# EAGLE design Board Old (EAGLE 9.6.2)
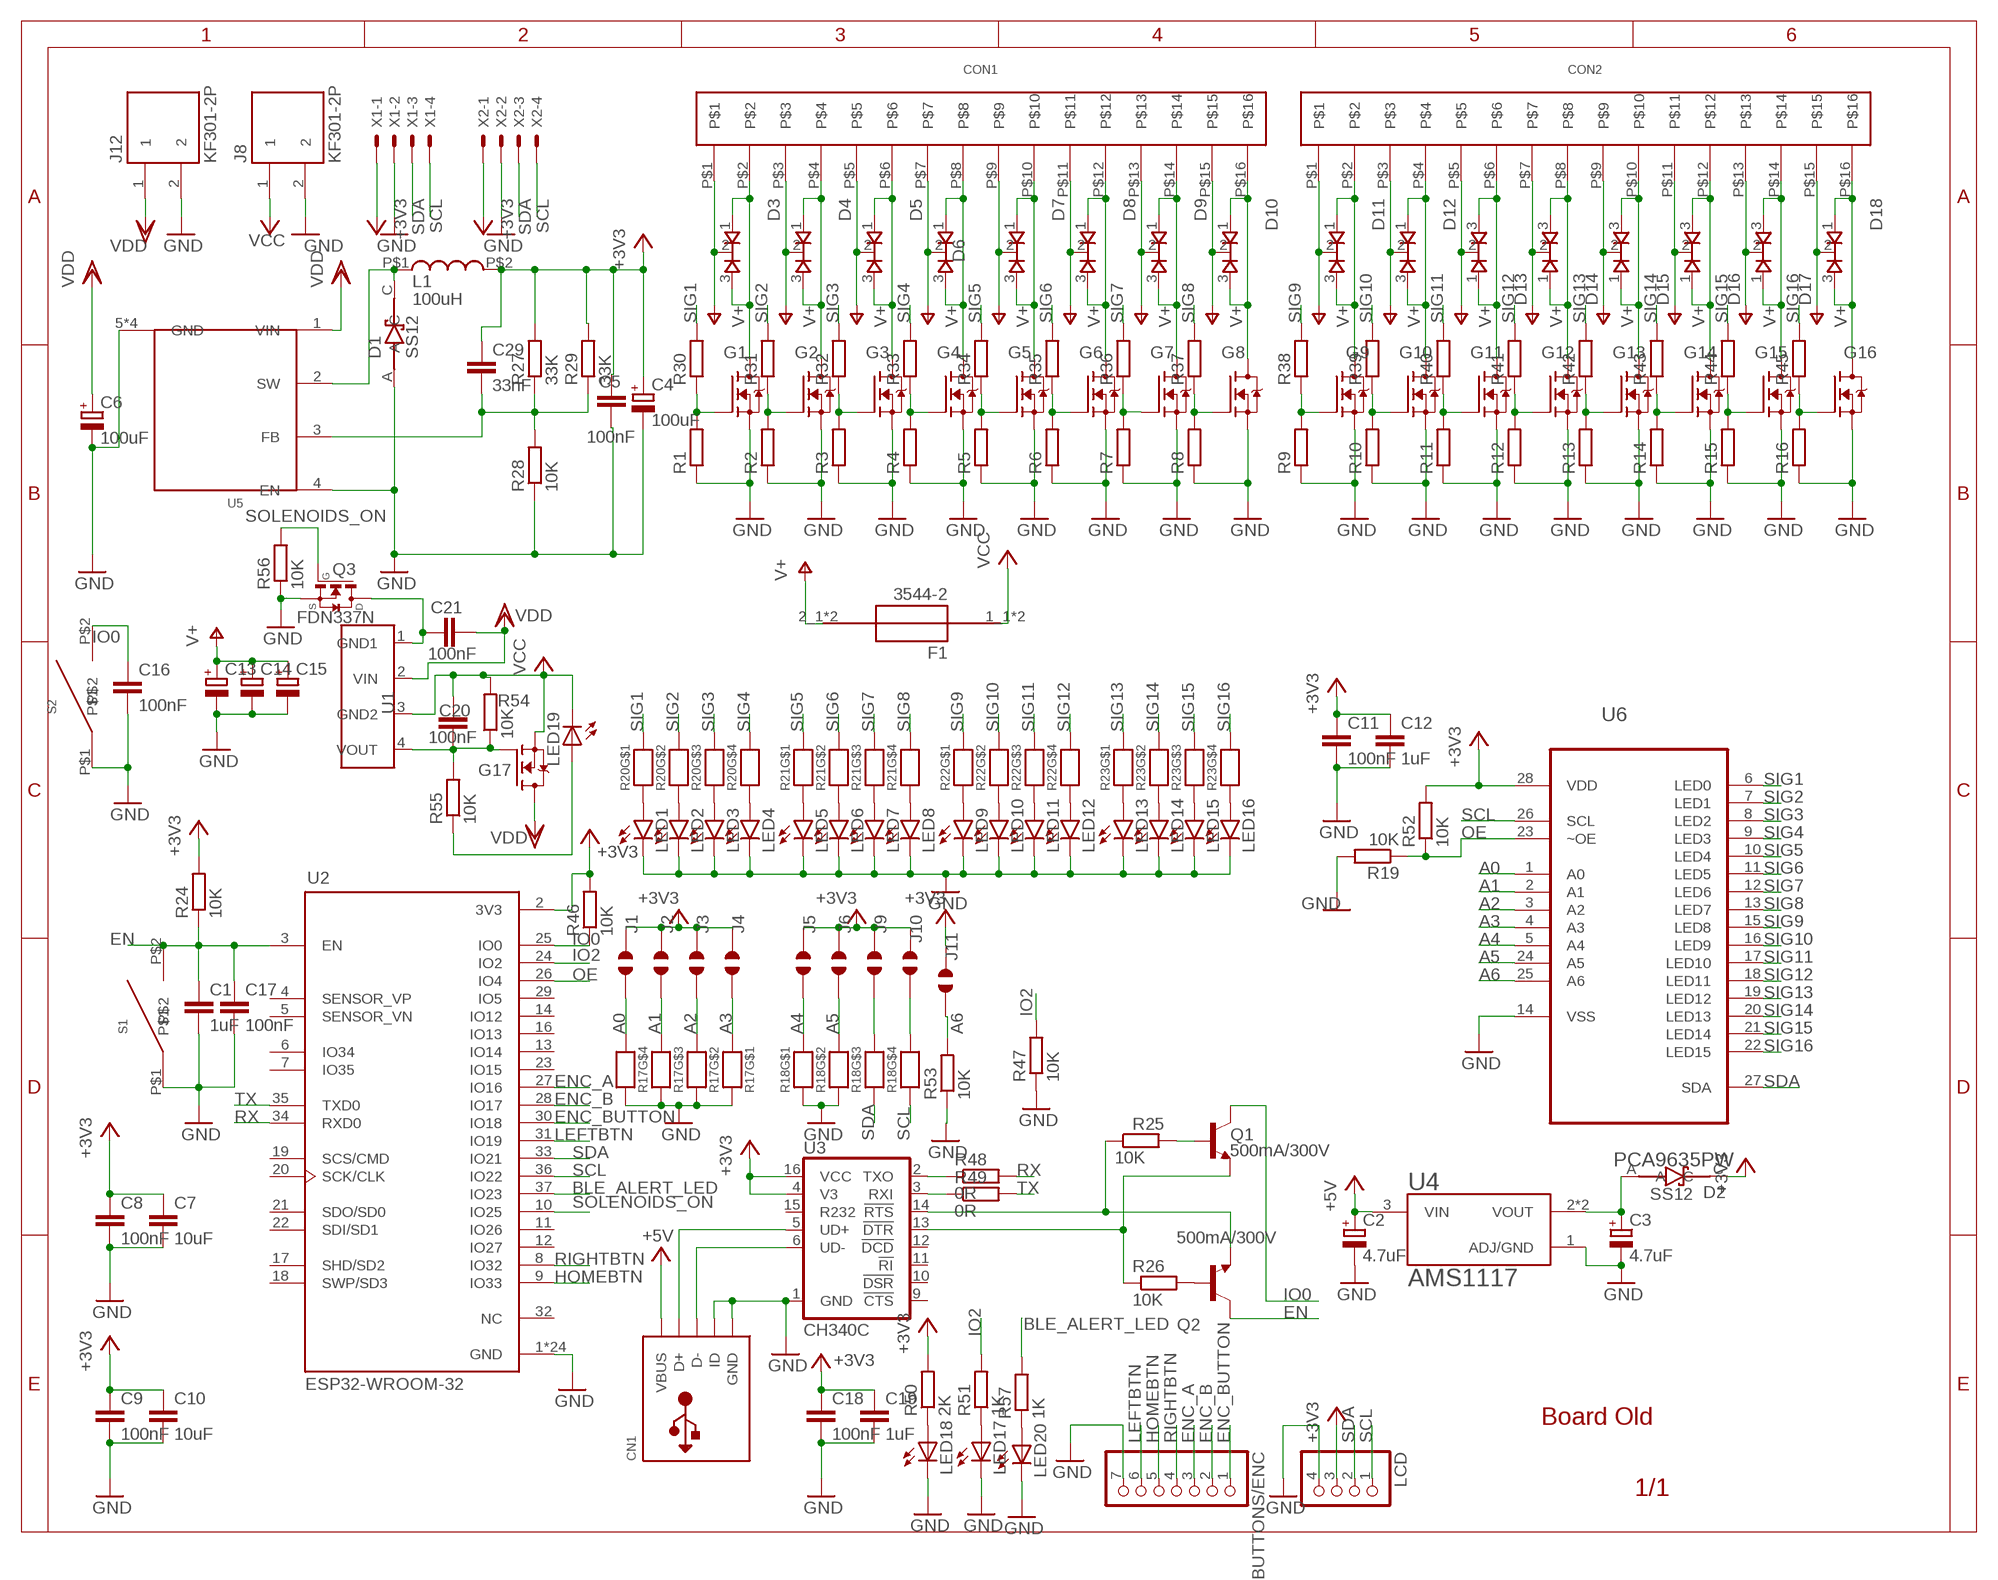
[diagram p0: schematic, sheet 1]

## Parts
BUTTONS/ENC  PINHD-1X7  [1X07]
C1  1uF  C-EUC0603  [C0603]
C2  4.7uF  CPOL-EUC/6032-28R  [C/6032-28R]
C3  4.7uF  CPOL-EUC/6032-28R  [C/6032-28R]
C4  100uF  CPOL-EUC/6032-28R  [C/6032-28R]
C5  100nF  C-EUC0603  [C0603]
C6  100uF  CPOL-EUC/6032-28R  [C/6032-28R]
C7  10uF  C-EUC0603  [C0603]
C8  100nF  C-EUC0603  [C0603]
C9  100nF  C-EUC0603  [C0603]
C10  10uF  C-EUC0603  [C0603]
C11  100nF  C-EUC0603  [C0603]
C12  1uF  C-EUC0603  [C0603]
C13  CPOL-EUE5-10.5  [E5-10,5]
C14  CPOL-EUE5-10.5  [E5-10,5]
C15  CPOL-EUE5-10.5  [E5-10,5]
C16  100nF  C-EUC0603  [C0603]
C17  100nF  C-EUC0603  [C0603]
C18  100nF  C-EUC0603  [C0603]
C19  1uF  C-EUC0603  [C0603]
C20  100nF  C-EUC0603  [C0603]
C21  100nF  C-EUC0603  [C0603]
C29  33nF  C-EUC0603  [C0603]
CN1  USBMINIB  [USB-MINIB]
CON1  2.54-16P  [2.54-16P]
CON2  2.54-16P  [2.54-16P]
D1  SS12  [DIOM4427X270N]
D2  SS12  [DIOM4427X270N]
D3  BYQ28E  [TO220V]
D4  BYQ28E  [TO220V]
D5  BYQ28E  [TO220V]
D6  BYQ28E  [TO220V]
D7  BYQ28E  [TO220V]
D8  BYQ28E  [TO220V]
D9  BYQ28E  [TO220V]
D10  BYQ28E  [TO220V]
D11  BYQ28E  [TO220V]
D12  BYQ28E  [TO220V]
D13  BYQ28E  [TO220V]
D14  BYQ28E  [TO220V]
D15  BYQ28E  [TO220V]
D16  BYQ28E  [TO220V]
D17  BYQ28E  [TO220V]
D18  BYQ28E  [TO220V]
F1  3544-2  [FUSE_3544-2]
G1  IRL540N  [TO220V]
G2  IRL540N  [TO220V]
G3  IRL540N  [TO220V]
G4  IRL540N  [TO220V]
G5  IRL540N  [TO220V]
G6  IRL540N  [TO220V]
G7  IRL540N  [TO220V]
G8  IRL540N  [TO220V]
G9  IRL540N  [TO220V]
G10  IRL540N  [TO220V]
G11  IRL540N  [TO220V]
G12  IRL540N  [TO220V]
G13  IRL540N  [TO220V]
G14  IRL540N  [TO220V]
G15  IRL540N  [TO220V]
G16  IRL540N  [TO220V]
G17  IRL540N  [TO220V]
J1  JUMPER_SOLDER_1X2  [JUMPER_SOLDER_1X2]
J2  JUMPER_SOLDER_1X2  [JUMPER_SOLDER_1X2]
J3  JUMPER_SOLDER_1X2  [JUMPER_SOLDER_1X2]
J4  JUMPER_SOLDER_1X2  [JUMPER_SOLDER_1X2]
J5  JUMPER_SOLDER_1X2  [JUMPER_SOLDER_1X2]
J6  JUMPER_SOLDER_1X2  [JUMPER_SOLDER_1X2]
J8  KF301-2P  [KF301-2P]
J9  JUMPER_SOLDER_1X2  [JUMPER_SOLDER_1X2]
J10  JUMPER_SOLDER_1X2  [JUMPER_SOLDER_1X2]
J11  JUMPER_SOLDER_1X2  [JUMPER_SOLDER_1X2]
J12  KF301-2P  [KF301-2P]
L1  100uH  CD43  [CD43]
LCD  PINHD-1X4  [1X04]
LED1  LEDSMT1206  [1206]
LED2  LEDSMT1206  [1206]
LED3  LEDSMT1206  [1206]
LED4  LEDSMT1206  [1206]
LED5  LEDSMT1206  [1206]
LED6  LEDSMT1206  [1206]
LED7  LEDSMT1206  [1206]
LED8  LEDSMT1206  [1206]
LED9  LEDSMT1206  [1206]
LED10  LEDSMT1206  [1206]
LED11  LEDSMT1206  [1206]
LED12  LEDSMT1206  [1206]
LED13  LEDSMT1206  [1206]
LED14  LEDSMT1206  [1206]
LED15  LEDSMT1206  [1206]
LED16  LEDSMT1206  [1206]
LED17  LED-0603  [LED-603]
LED18  LED-0603  [LED-603]
LED19  LED-0603  [LED-603]
LED20  LED-0603  [LED-603]
Q1  500mA/300V  TRANS_NPN-MMBTA42  [SOT23-3]
Q2  500mA/300V  TRANS_NPN-MMBTA42  [SOT23-3]
Q3  FDN337N  [SSOT-3]
R1  R-EU_R0603  [R0603]
R2  R-EU_R0603  [R0603]
R3  R-EU_R0603  [R0603]
R4  R-EU_R0603  [R0603]
R5  R-EU_R0603  [R0603]
R6  R-EU_R0603  [R0603]
R7  R-EU_R0603  [R0603]
R8  R-EU_R0603  [R0603]
R9  R-EU_R0603  [R0603]
R10  R-EU_R0603  [R0603]
R11  R-EU_R0603  [R0603]
R12  R-EU_R0603  [R0603]
R13  R-EU_R0603  [R0603]
R14  R-EU_R0603  [R0603]
R15  R-EU_R0603  [R0603]
R16  R-EU_R0603  [R0603]
R17  MICROBUILDER_RESISTOR_4PACK  [MICROBUILDER_RESPACK_4X0603]
R18  MICROBUILDER_RESISTOR_4PACK  [MICROBUILDER_RESPACK_4X0603]
R19  10K  R-EU_R1206  [R1206]
R20  MICROBUILDER_RESISTOR_4PACK  [MICROBUILDER_RESPACK_4X0603]
R21  MICROBUILDER_RESISTOR_4PACK  [MICROBUILDER_RESPACK_4X0603]
R22  MICROBUILDER_RESISTOR_4PACK  [MICROBUILDER_RESPACK_4X0603]
R23  MICROBUILDER_RESISTOR_4PACK  [MICROBUILDER_RESPACK_4X0603]
R24  10K  R-EU_R0603  [R0603]
R25  10K  R-EU_R0603  [R0603]
R26  10K  R-EU_R0603  [R0603]
R27  33K  R-EU_R0603  [R0603]
R28  10K  R-EU_R0603  [R0603]
R29  33K  R-EU_R0603  [R0603]
R30  R-EU_R0603  [R0603]
R31  R-EU_R0603  [R0603]
R32  R-EU_R0603  [R0603]
R33  R-EU_R0603  [R0603]
R34  R-EU_R0603  [R0603]
R35  R-EU_R0603  [R0603]
R36  R-EU_R0603  [R0603]
R37  R-EU_R0603  [R0603]
R38  R-EU_R0603  [R0603]
R39  R-EU_R0603  [R0603]
R40  R-EU_R0603  [R0603]
R41  R-EU_R0603  [R0603]
R42  R-EU_R0603  [R0603]
R43  R-EU_R0603  [R0603]
R44  R-EU_R0603  [R0603]
R45  R-EU_R0603  [R0603]
R46  10K  R-EU_R0603  [R0603]
R47  10K  R-EU_R0603  [R0603]
R48  0R  R-EU_R0603  [R0603]
R49  0R  R-EU_R0603  [R0603]
R50  2K  R-EU_R0603  [R0603]
R51  1K  R-EU_R0603  [R0603]
R52  10K  R-EU_R0603  [R0603]
R53  10K  R-EU_R0603  [R0603]
R54  10K  R-EU_R0603  [R0603]
R55  10K  R-EU_R0603  [R0603]
R56  10K  R-EU_R0603  [R0603]
R57  1K  R-EU_R0603  [R0603]
S1  3X6X2.5  [3X6X2.5]
S2  3X6X2.5  [3X6X2.5]
U1  B1212  [CONV_PDS1-S15-S12-S]
U2  ESP32-WROOM-32  [MODULE_ESP32-WROOM-32]
U3  CH340C  [SO016]
U4  AMS1117  [SOT229P700X180-4N]
U5  XL7005A  [SO8]
U6  PCA9635PW  [SOP65P640X110-28N]
X1  JST-XH-04-PIN-LONG-PAD  [JST-XH-04-PACKAGE-LONG-PAD]
X2  JST-XH-04-PIN-LONG-PAD  [JST-XH-04-PACKAGE-LONG-PAD]

## Nets
+3V3: C4.+ C5.1 C7.1 C8.1 C9.1 C10.1 C11.1 C12.1 C18.1 C19.1 C29.1 D2.C J1.1 J2.1 J3.1 J4.1 J5.1 J6.1 J9.1 J10.1 J11.1 L1.P$2 LCD.3 R24.2 R27.2 R29.2 R46.2 R50.2 R52.2 U2.2(3V3) U3.4(V3) U3.16(VCC) U6.28(VDD) X1.1 X2.1
+5V: C2.+ CN1.VBUS U4.3(VIN)
A0: J1.2 R17.4 U6.1(A0)
A1: J2.2 R17.3 U6.2(A1)
A2: J3.2 R17.2 U6.3(A2)
A3: J4.2 R17.1 U6.4(A3)
A4: J5.2 R18.8 U6.5(A4)
A5: J6.2 R18.7 U6.24(A5)
A6: J11.2 R53.2 U6.25(A6)
BLE_ALERT_LED: R57.2 U2.37(IO23)
EN: C1.1 C17.1 Q2.3(C) R24.1 S1.P$2 U2.3(EN)
ENC_A: BUTTONS/ENC.3 U2.27(IO16)
ENC_B: BUTTONS/ENC.2 U2.28(IO17)
ENC_BUTTON: BUTTONS/ENC.1 U2.30(IO18)
GND: BUTTONS/ENC.7 C1.2 C2.- C3.- C4.- C5.2 C6.- C7.2 C8.2 C9.2 C10.2 C11.2 C12.2 C13.- C14.- C15.- C16.2 C17.2 C18.2 C19.2 CN1.GND CN1.ID D1.A G1.3(S) G2.3(S) G3.3(S) G4.3(S) G5.3(S) G6.3(S) G7.3(S) G8.3(S) G9.3(S) G10.3(S) G11.3(S) G12.3(S) G13.3(S) G14.3(S) G15.3(S) G16.3(S) J8.2 J12.2 LCD.4 LED1.C LED2.C LED3.C LED4.C LED5.C LED6.C LED7.C LED8.C LED9.C LED10.C LED11.C LED12.C LED13.C LED14.C LED15.C LED16.C LED17.C LED18.C LED20.C Q3.2(S) R1.1 R2.1 R3.1 R4.1 R5.1 R6.1 R7.1 R8.1 R9.1 R10.1 R11.1 R12.1 R13.1 R14.1 R15.1 R16.1 R17.5 R17.6 R17.7 R17.8 R18.1 R18.2 R19.2 R28.1 R47.1 R53.1 R56.1 S1.P$1 S2.P$1 U2.1(GND) U2.15(GND) U2.38(GND) U2.39_1(GND) U2.39_2(GND) U2.39_3(GND) U2.39_4(GND) U2.39_5(GND) U2.39_6(GND) U2.39_7(GND) U2.39_8(GND) U2.39_9(GND) U2.39_10(GND) U2.39_11(GND) U2.39_12(GND) U2.39_13(GND) U2.39_14(GND) U2.39_15(GND) U2.39_16(GND) U2.39_17(GND) U2.39_18(GND) U2.39_19(GND) U2.39_20(GND) U2.39_21(GND) U3.1(GND) U4.1(ADJ/GND) U5.4(EN) U5.5(GND) U5.6(GND) U5.7(GND) U5.8(GND) U6.14(VSS) X1.2 X2.2
HOMEBTN: BUTTONS/ENC.5 U2.9(IO33)
IO0: C16.1 Q1.3(C) R46.1 S2.P$2 U2.25(IO0)
IO2: R47.2 R51.2 U2.24(IO2)
LEFTBTN: BUTTONS/ENC.6 U2.31(IO19)
N$1 [power]: CON1.P$2 D3.1 D3.3 G1.2(D)
N$2 [power]: CON1.P$4 D4.1 D4.3 G2.2(D)
N$3 [power]: CON1.P$6 D5.1 D5.3 G3.2(D)
N$4 [power]: CON1.P$8 D6.1 D6.3 G4.2(D)
N$5 [power]: CON1.P$10 D7.1 D7.3 G5.2(D)
N$6 [power]: CON1.P$12 D8.1 D8.3 G6.2(D)
N$7 [power]: CON1.P$14 D9.1 D9.3 G7.2(D)
N$8 [power]: CON1.P$16 D10.1 D10.3 G8.2(D)
N$9 [power]: CON2.P$2 D11.1 D11.3 G9.2(D)
N$10 [power]: CON2.P$4 D12.1 D12.3 G10.2(D)
N$11 [power]: CON2.P$6 D13.1 D13.3 G11.2(D)
N$12 [power]: CON2.P$8 D14.1 D14.3 G12.2(D)
N$13 [power]: CON2.P$10 D15.1 D15.3 G13.2(D)
N$14 [power]: CON2.P$12 D16.1 D16.3 G14.2(D)
N$15 [power]: CON2.P$14 D17.1 D17.3 G15.2(D)
N$16 [power]: CON2.P$16 D18.1 D18.3 G16.2(D)
N$17: Q1.1(B) R25.2
N$18: Q2.1(B) R26.2
N$19: LED1.A R20.1
N$20: LED2.A R20.2
N$21: LED3.A R20.3
N$22: LED4.A R20.4
N$23: LED5.A R21.1
N$24: LED6.A R21.2
N$25: LED7.A R21.3
N$26: G1.1(G) R1.2 R30.1
N$27: LED8.A R21.4
N$28: LED9.A R22.1
N$29: LED10.A R22.2
N$30: LED11.A R22.3
N$31: LED12.A R22.4
N$32: LED13.A R23.1
N$33: LED14.A R23.2
N$34: LED15.A R23.3
N$35: Q2.2(E) R25.1 U3.14(!RTS)
N$36: Q1.2(E) R26.1 U3.13(!DTR)
N$37: C20.2 G17.1(G) R54.1 R55.2 U1.4(VOUT)
N$38: J9.2 R18.6
N$39: CN1.D- U3.6(UD-)
N$40: CN1.D+ U3.5(UD+)
N$41: J10.2 R18.5
N$42: C3.+ D2.A U4.2(VOUT) U4.4(VOUT)
N$43: LED16.A R23.4
N$44: C29.2 R27.1 R28.2 R29.1 U5.3(FB)
N$45: G2.1(G) R2.2 R31.1
N$46: R48.1 U3.2(TXO)
N$47: G3.1(G) R3.2 R32.1
N$48: R49.1 U3.3(RXI)
N$49: G4.1(G) R4.2 R33.1
N$50: LED20.A R57.1
N$51: G5.1(G) R5.2 R34.1
N$52: G6.1(G) R6.2 R35.1
N$53: G7.1(G) R7.2 R36.1
N$54: LED18.A R50.1
N$55: G8.1(G) R8.2 R37.1
N$56: G9.1(G) R9.2 R38.1
N$57: G10.1(G) R10.2 R39.1
N$58: G11.1(G) R11.2 R40.1
N$59: G12.1(G) R12.2 R41.1
N$60: G13.1(G) R13.2 R42.1
N$61: G14.1(G) R14.2 R43.1
N$62: G15.1(G) R15.2 R44.1
N$63: G16.1(G) R16.2 R45.1
N$64: LED17.A R51.1
N$65: D1.C L1.P$1 U5.2(SW)
N$66: LED19.A R55.1
N$67: C21.1 Q3.3(D) U1.1(GND1)
OE: R19.1 R52.1 U2.26(IO4) U6.23(~OE)
RIGHTBTN: BUTTONS/ENC.4 U2.8(IO32)
RX: R48.2 U2.34(RXD0)
SCL: LCD.1 R18.4 U2.36(IO22) U6.26(SCL) X1.4 X2.4
SDA: LCD.2 R18.3 U2.33(IO21) U6.27(SDA) X1.3 X2.3
SIG1: R20.8 R30.2 U6.6(LED0)
SIG2: R20.7 R31.2 U6.7(LED1)
SIG3: R20.6 R32.2 U6.8(LED2)
SIG4: R20.5 R33.2 U6.9(LED3)
SIG5: R21.8 R34.2 U6.10(LED4)
SIG6: R21.7 R35.2 U6.11(LED5)
SIG7: R21.6 R36.2 U6.12(LED6)
SIG8: R21.5 R37.2 U6.13(LED7)
SIG9: R22.8 R38.2 U6.15(LED8)
SIG10: R22.7 R39.2 U6.16(LED9)
SIG11: R22.6 R40.2 U6.17(LED10)
SIG12: R22.5 R41.2 U6.18(LED11)
SIG13: R23.8 R42.2 U6.19(LED12)
SIG14: R23.7 R43.2 U6.20(LED13)
SIG15: R23.6 R44.2 U6.21(LED14)
SIG16: R23.5 R45.2 U6.22(LED15)
SOLENOIDS_ON: Q3.1(G) R56.2 U2.10(IO25)
TX: R49.2 U2.35(TXD0)
V+: C13.+ C14.+ C15.+ CON1.P$1 CON1.P$3 CON1.P$5 CON1.P$7 CON1.P$9 CON1.P$11 CON1.P$13 CON1.P$15 CON2.P$1 CON2.P$3 CON2.P$5 CON2.P$7 CON2.P$9 CON2.P$11 CON2.P$13 CON2.P$15 D3.2 D4.2 D5.2 D6.2 D7.2 D8.2 D9.2 D10.2 D11.2 D12.2 D13.2 D14.2 D15.2 D16.2 D17.2 D18.2 F1.2_1 F1.2_2
VCC [power]: C20.1 F1.1_1 F1.1_2 G17.3(S) J8.1 LED19.C R54.2 U1.3(GND2)
VDD [power]: C6.+ C21.2 G17.2(D) J12.1 U1.2(VIN) U5.1(VIN)
Unconnected: U2.4(SENSOR_VP) U2.5(SENSOR_VN) U2.6(IO34) U2.7(IO35) U2.11(IO26) U2.12(IO27) U2.13(IO14) U2.14(IO12) U2.16(IO13) U2.17(SHD/SD2) U2.18(SWP/SD3) U2.19(SCS/CMD) U2.20(SCK/CLK) U2.21(SDO/SD0) U2.22(SDI/SD1) U2.23(IO15) U2.29(IO5) U2.32(NC) U3.9(!CTS) U3.10(!DSR) U3.11(!RI) U3.12(!DCD) U3.15(R232)

## Library data of the parts
BUTTONS/ENC = pinhead:PINHD-1X7: PIN HEADER
C1 C5 C7-C12 C16-C21 C29 = rcl:C-EU: CAPACITOR, European symbol; SPICEPREFIX: C
C2-C4 C6 C13-C15 = rcl:CPOL-EU: POLARIZED CAPACITOR, European symbol; SPICEPREFIX: C
CN1 = adafruit:USB: USB Connectors USBMINIB - Surface Mount Female Mini-B USB Connector 4UConnector: 06564 By microbuilder.eu Thru-hole RA Female Mini-B USB Connector 4UConnector: 18732 By ladyada.net
CON1 CON2 = Screw Terminals:2.54-16P
D1 D2 = SS12:SS12: SS12 Series 500 mV 1 A 20 V Max Reverse Voltage Schottky Rectifier - DO-214AC Check prices <https://pricing.snapeda.com/parts/SS12/ON%20Semiconductor/view-part?ref=eda>; AVAILABILITY: In Stock; DESCRIPTION: 3/8 Hex Socket Nut Driver 3.75 (95.3mm); MF: ON Semiconductor; MP: SS12; PACKAGE: SMA-2 ON Semiconductor; PRICE: None; PURCHASE-URL: https://pricing.snapeda.com/search/part/SS12/?ref=eda
D3-D18 = BYQ28E:BYQ28E
F1 = 3544-2 Mini Auto Blade Fuse Holder:3544-2: Fuse Clip; 500 VAC; 30 A; PCB; For 0.110 in. x 0.032 in. mini blade fuses Check availability <https://pricing.snapeda.com/parts/3544-2/Keystone%20Electronics/view-part?ref=eda>; AVAILABILITY: In Stock; DESCRIPTION: THM-Vertical Entry Mini Auto Fuse Holder; MF: Keystone Electronics; MP: 3544-2; PACKAGE: None; PRICE: None; PURCHASE-URL: https://pricing.snapeda.com/search/part/3544-2/?ref=eda
G1-G17 = IRL540N:IRL540N
J1-J6 J9-J11 = dp_devices:JUMPER_SOLDER_1X2
J8 J12 = Screw Terminals:KF301-2P: 2 Pin Terminal Block 5mm Pitch Check availability <https://pricing.snapeda.com/parts/KF301-2P/Handson%20Technology/view-part?ref=eda>; AVAILABILITY: Not in stock; DESCRIPTION: 2 Pin Terminal Block 5mm Pitch; MF: Handson Technology; MP: KF301-2P; PACKAGE: None; PRICE: None
L1 = CDXX Unshielded Inductors:CD43
LCD = pinhead:PINHD-1X4: PIN HEADER
LED1-LED16 = led:LED: LED OSRAM: - CHIPLED LG R971, LG N971, LY N971, LG Q971, LY Q971, LO R971, LY R971 LH N974, LH R974 LS Q976, LO Q976, LY Q976 LO Q996 - Hyper CHIPLED LW Q18S LB Q993, LB Q99A, LB R99A - SideLED LS A670, LO A670, LY A670, LG A670, LP A670 LB A673, LV A673, LT A673, LW A673 LH A674 LY A675 LS A676, LA A676, LO A676, LY A676, LW A676 LS A679, LY A679, LG A679 - Hyper Micro SIDELED® LS Y876, LA Y876, LO Y876, LY Y876 LT Y87S - SmartLED LW L88C, LW L88S LB L89C, LB L89S, LG L890 LS L89K, LO L89K, LY L89K LS L896, LA L896, LO L896, LY L896 - TOPLED LS T670, LO T670, LY T670, LG T670, LP T670 LSG T670, LSP T670, LSY T670, LOP T670, LYG T670 LG T671, LOG T671, LSG T671 LB T673, LV T673, LT T673, LW T673 LH T674 LS T676, LA T676, LO T676, LY T676, LB T676, LH T676, LSB T676, LW T676 LB T67C, LV T67C, LT T67C, LS T67K, LO T67K, LY T67K, LW E67C LS E67B, LA E67B, LO E67B, LY E67B, LB E67C, LV E67C, LT E67C LW T67C LS T679, LY T679, LG T679 LS T770, LO T770, LY T770, LG T770, LP T770 LB T773, LV T773, LT T773, LW T773 LH T774 LS E675, LA E675, LY E675, LS T675 LS T776, LA T776, LO T776, LY T776, LB T776 LHGB T686 LT T68C, LB T68C - Hyper Mini TOPLED® LB M676 - Mini TOPLED Santana® LG M470 LS M47K, LO M47K, LY M47K Source: http://www.osram.convergy.de LUXEON: - LUMILED® LXK2-PW12-R00, LXK2-PW12-S00, LXK2-PW14-U00, LXK2-PW14-V00 LXK2-PM12-R00, LXK2-PM12-S00, LXK2-PM14-U00 LXK2-PE12-Q00, LXK2-PE12-R00, LXK2-PE12-S00, LXK2-PE14-T00, LXK2-PE14-U00 LXK2-PB12-K00, LXK2-PB12-L00, LXK2-PB12-M00, LXK2-PB14-N00, LXK2-PB14-P00, LXK2-PB14-Q00 LXK2-PR12-L00, LXK2-PR12-M00, LXK2-PR14-Q00, LXK2-PR14-R00 LXK2-PD12-Q00, LXK2-PD12-R00, LXK2-PD12-S00 LXK2-PH12-R00, LXK2-PH12-S00 LXK2-PL12-P00, LXK2-PL12-Q00, LXK2-PL12-R00 Source: www.luxeon.com KINGBRIGHT: KA-3528ASYC Source: www.kingbright.com
LED17-LED20 = dp_devices:LED: Light Emitting Diode
Q1 Q2 = SparkFun-DiscreteSemi:TRANS_NPN: NPN transistor Current controlled devices typically used to amplify current or used as a switch. BC547 - COM-08928 <http://www.sparkfun.com/products/8928> (TO-92 45V 100mA) (1.Collector 2.Base 3.Emitter) 2N3904 - COM-00521 <http://www.sparkfun.com/products/521> (TO-92 40V 200mA) (1.Emitter 2.Base 3.Collector) P2N2222A - COM-12852 <http://www.sparkfun.com/products/12852> (TO-92 40V 600mA) (1.Collector 2.Base 3.Emitter); PROD_ID: TRANS-09116
Q3 = FDN337N:FDN337N: N-Channel MOSFET Logic Level Enhancement Mode Field Effect Transistor Check prices <https://pricing.snapeda.com/parts/FDN337N/ON%20Semiconductor/view-part?ref=eda>; AVAILABILITY: In Stock; DESCRIPTION: FDN337 Series 30 V 65 mOhm N-Ch Field Effect Transistor - SSOT-3; MF: ON Semiconductor; MP: FDN337N; PACKAGE: TO-236-3 ON; PRICE: None; PURCHASE-URL: https://pricing.snapeda.com/search/part/FDN337N/?ref=eda
R1-R16 R19 R24-R57 = rcl:R-EU_: RESISTOR, European symbol; SPICEPREFIX: R
R17 R18 R20-R23 = Adafruit PCA9685 rev C:MICROBUILDER_RESISTOR_4PACK: Resistor Packs (4 resistors) 4 x 0603 10K 1/16W - Digikey: YC164J-10KCT-ND
S1 S2 = Microbuttons:3X6X2.5
U1 = B1212:B1212
U2 = ESP32-WROOM-32:ESP32-WROOM-32: Check availability <https://pricing.snapeda.com/parts/ESP32-WROOM-32/Espressif%20Systems/view-part?ref=eda>; AVAILABILITY: In Stock; DESCRIPTION: Bluetooth, WiFi 802.11b/g/n, Bluetooth v4.2 +EDR, Class 1, 2 and 3 Transceiver Module 2.4GHz ~ 2.5GHz Antenna Not Included, U.FL Surface Mount; MF: Espressif Systems; MP: ESP32-WROOM-32; PACKAGE: Module Espressif Systems; PRICE: None; PURCHASE-URL: https://pricing.snapeda.com/search/part/ESP32-WROOM-32/?ref=eda
U3 = CH340C:CH340C; AVAILABILITY: Unavailable; DESCRIPTION: USB to serial chip CH340; MF: WCH; MP: CH340C; PACKAGE: Package; PRICE: None
U4 = AMS1117:AMS1117: Sot223/Pkg 1-Amp 5-Volt Low Drop Out Voltage Regulatator Check prices <https://pricing.snapeda.com/parts/AMS1117/Advanced%20Monolithic%20Systems/view-part?ref=eda>; AVAILABILITY: In Stock; DESCRIPTION: 1A LOW DROPOUT VOLTAGE REGULATOR SOT-223; MF: Advanced Monolithic Systems; MP: AMS1117; PACKAGE: SOT-223 Seeed Technology; PRICE: None
U5 = XL7005A:XL7005A
U6 = PCA9635PW:PCA9635PW: 16-bit Fm+ I2C-bus LED driver Check availability <https://pricing.snapeda.com/parts/PCA9635PW/NXP%20Semiconductors/view-part?ref=eda>; AVAILABILITY: In Stock; DESCRIPTION: LED Driver IC 16 Output Linear - PWM Dimming 25mA 28-TSSOP; MF: NXP Semiconductors; MP: PCA9635PW; PACKAGE: TSSOP-28 NXP USA; PRICE: None; PURCHASE-URL: https://pricing.snapeda.com/search/part/PCA9635PW/?ref=eda
X1 X2 = Rembrandt Electronics - JST XH Connectors v1-0:JST-XH-04-PIN: JST XH Connector 2 Pin Wire to board connector. Pitch: 2,54 mm, (0.100") Number of pins: 4 Created by Rembrandt Electronics www.rembrandtelectronics.com

## Net classes
1 power: clearance 0.254 mm

## Board
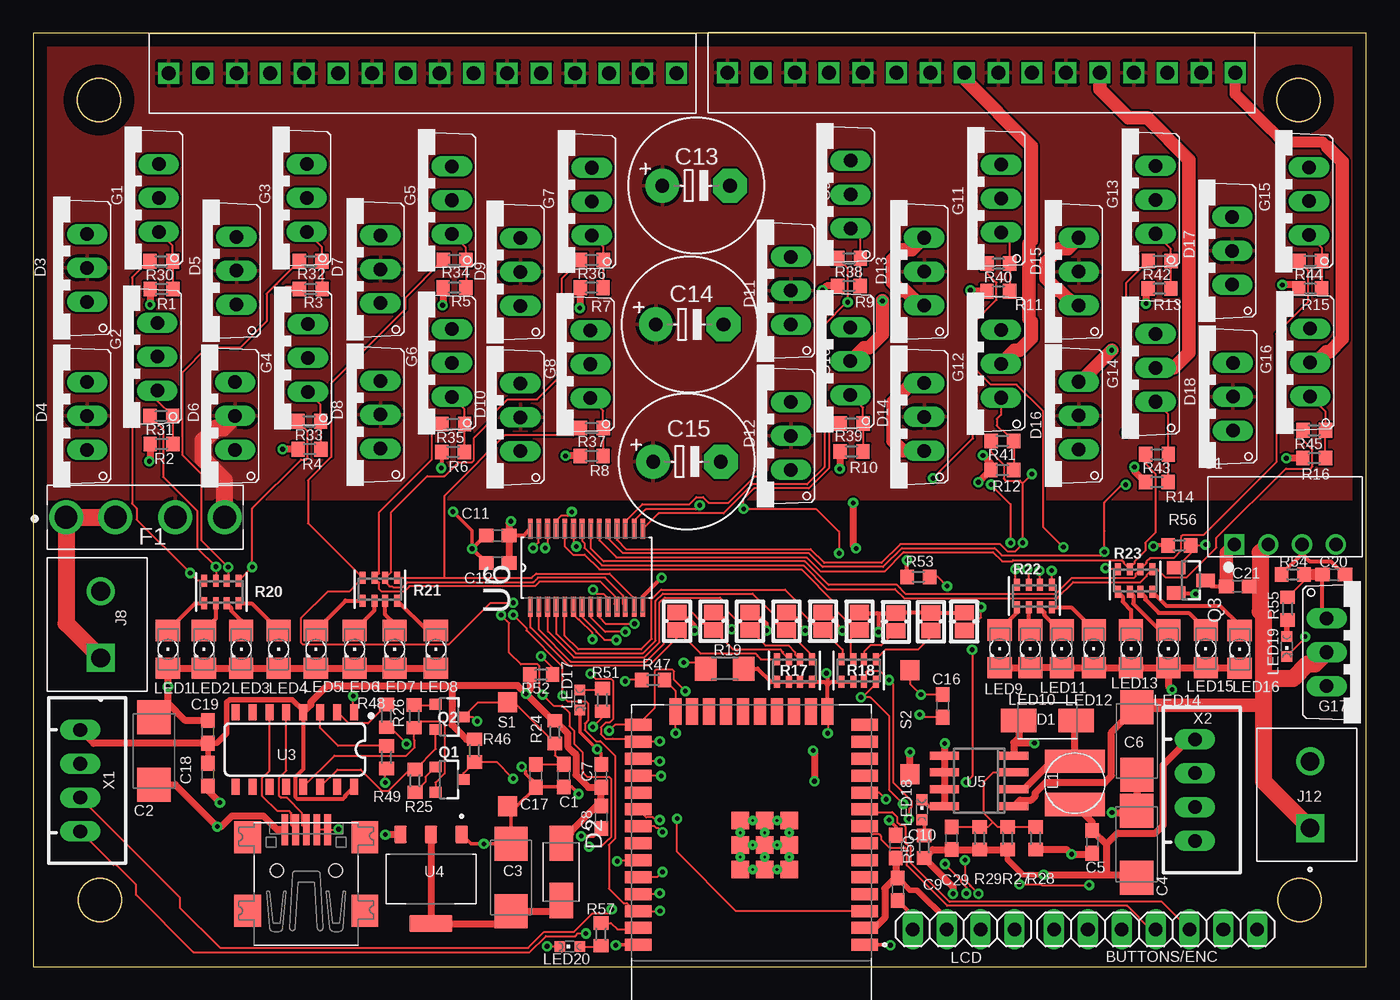
[diagram p1: board, top side]
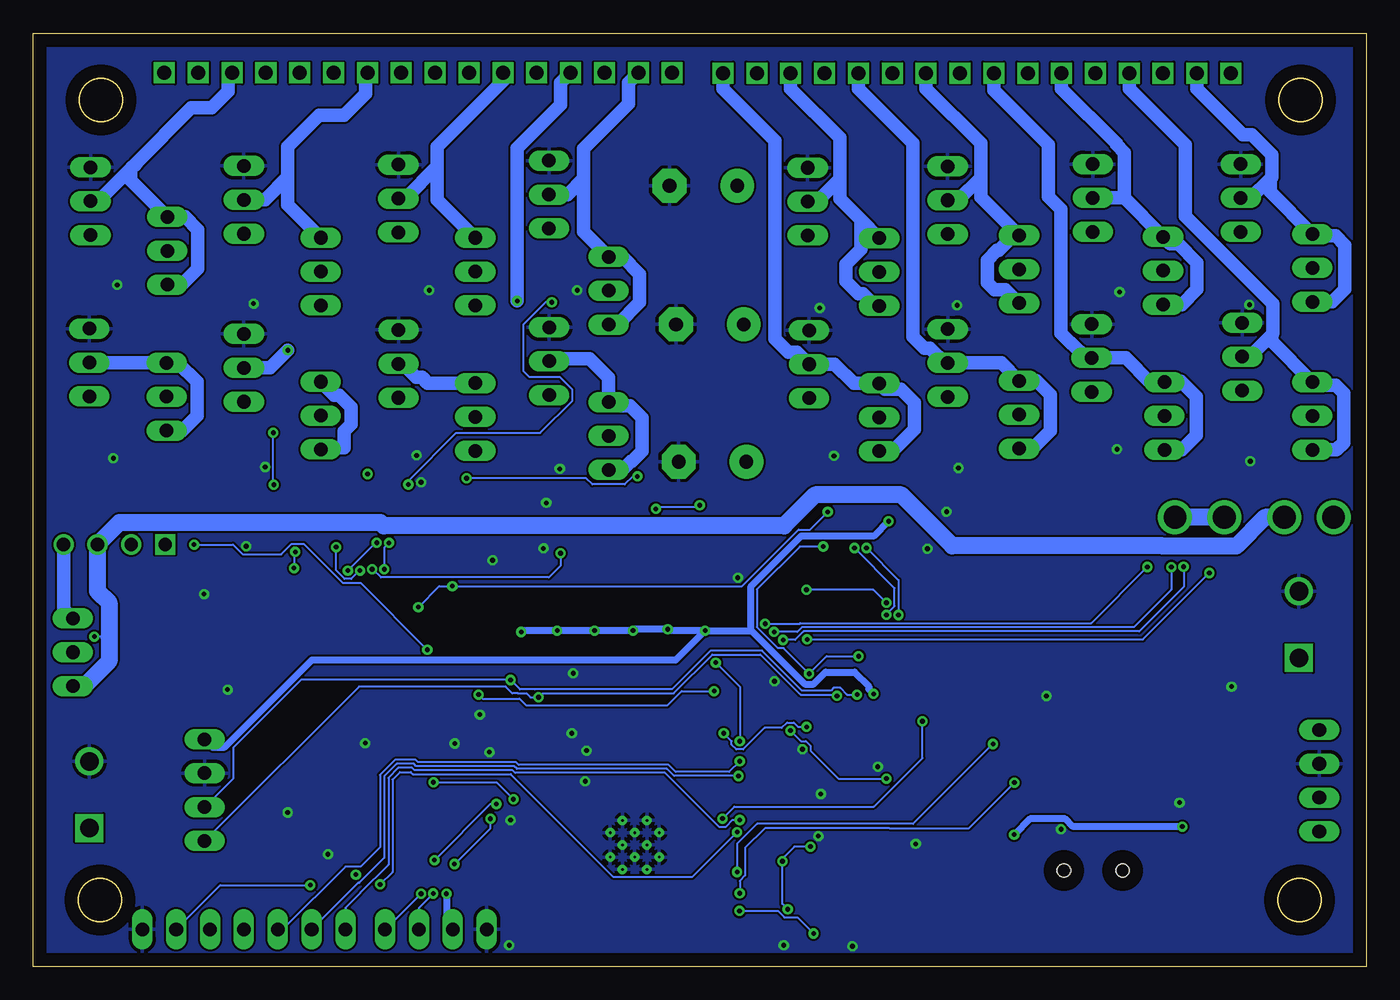
[diagram p2: board, bottom side, seen from below]

Size 100 x 70 mm. Coordinates in mm from the lower left corner, seen from the top.
Outline: 100,0 100,70 0,70 0,0 100,0
Outline: circle at 4.94,65 radius 1.62
Outline: circle at 5,5 radius 1.62
Outline: circle at 94.94,65 radius 1.62
Outline: circle at 95,5 radius 1.62
Copper layers (1*16): Top 0.035mm / dielectric 1.5mm / Bottom 0.035mm
Design rules "default": minimum track width 6mil, minimum drill 0.35mm, track to track 6mil, track to pad 6mil, pad to pad 6mil, via to via 6mil, smd to smd 6mil, copper to edge 40mil, drill to drill 6mil, minimum pad ring 10mil, minimum via ring 8mil, stop-mask expansion 4mil, vias tented up to drill 0mil, thermal gap 10mil

### Footprints (pad centres in the part's own frame; a part is rotated, then mirrored left to right if it is on the bottom)
1X07 = drill 1.016 long: 1 -7.62,0; 2 -5.08,0; 3 -2.54,0; 4 0,0; 5 2.54,0; 6 5.08,0; 7 7.62,0
C0603 = smd 1.1 x 1: 1 -0.85,0; 2 0.85,0
C/6032-28R = smd 2.55 x 2.5: + 2.525,0; - -2.525,0
E5-10,5 = drill 1.016 pad 2.54: + -2.54,0 | drill 1.016 pad 2.54 octagon: - 2.54,0
USB-MINIB = smd 0.5 x 2.308: D+ 0,4.064; D- -0.8,4.064; GND 1.6,4.064; ID 0.8,4.064; VBUS -1.6,4.064 | smd 2 x 2.4: GND1 -4.4,-2; GND2 -4.4,3.5; GND3 4.4,3.5; GND4 4.4,-2 | hole 1: -2.2,1; 2.2,1
2.54-16P = drill 1.05 square: P$1 -19.05,0; P$2 -16.51,0; P$3 -13.97,0; P$4 -11.43,0; P$5 -8.89,0; P$6 -6.35,0; P$7 -3.81,0; P$8 -1.27,0; P$9 1.27,0; P$10 3.81,0; P$11 6.35,0; P$12 8.89,0; P$13 11.43,0; P$14 13.97,0; P$15 16.51,0; P$16 19.05,0
DIOM4427X270N = smd 2.65 x 1.75: A 2.15,0; C -2.15,0
TO220V = drill 1.016 long: 1 -2.54,-2.54; 2 0,-2.54; 3 2.54,-2.54
FUSE_3544-2 = drill 1.7: 1_1 -5.95,0; 1_2 -2.25,0; 2_1 2.25,0; 2_2 5.95,0
JUMPER_SOLDER_1X2 = smd 1.143 x 1.422: 1 -0.66,0; 2 0.66,0
KF301-2P = drill 1.4 square: 1 -2.5,0 | drill 1.4: 2 2.5,0
CD43 = smd 4.5 x 1.75: P$1 0,1.625; P$2 0,-1.625
1X04 = drill 1.016 long: 1 -3.81,0; 2 -1.27,0; 3 1.27,0; 4 3.81,0
1206 = smd 1.6 x 1.803: A -1.422,0; C 1.422,0
LED-603 = smd 0.8 x 0.8: A 0,-0.75; C 0,0.75
SOT23-3 = smd 0.8 x 0.9: 1 -0.95,-1; 2 0.95,-1; 3 0,1.1
SSOT-3 = smd 1 x 1.4: 1 -0.95,-1.1; 2 0.95,-1.1; 3 0,1.1
R0603 = smd 1 x 1.1: 1 -0.85,0; 2 0.85,0
MICROBUILDER_RESPACK_4X0603 = smd 0.45 x 0.9: 1 -1.3,-0.85; 2 -0.4,-0.85; 3 0.4,-0.85; 4 1.3,-0.85; 5 1.3,0.85; 6 0.4,0.85; 7 -0.4,0.85; 8 -1.3,0.85
R1206 = smd 1.6 x 1.803: 1 -1.422,0; 2 1.422,0
3X6X2.5 = smd 1.5 x 1.4: P$1 -3.9,0; P$2 3.9,0
CONV_PDS1-S15-S12-S = drill 1 square: 1 -3.81,-2.1 | drill 1: 2 -1.27,-2.1; 3 1.27,-2.1; 4 3.81,-2.1
MODULE_ESP32-WROOM-32 = smd 2 x 0.9: 1 -8.5,5.26; 2 -8.5,3.99; 3 -8.5,2.72; 4 -8.5,1.45; 5 -8.5,0.18; 6 -8.5,-1.09; 7 -8.5,-2.36; 8 -8.5,-3.63; 9 -8.5,-4.9; 10 -8.5,-6.17; 11 -8.5,-7.44; 12 -8.5,-8.71; 13 -8.5,-9.98; 14 -8.5,-11.25; 25 8.5,-11.25; 26 8.5,-9.98; 27 8.5,-8.71; 28 8.5,-7.44; 29 8.5,-6.17; 30 8.5,-4.9; 31 8.5,-3.63; 32 8.5,-2.36; 33 8.5,-1.09; 34 8.5,0.18; 35 8.5,1.45; 36 8.5,2.72; 37 8.5,3.99; 38 8.5,5.26 | smd 0.9 x 2: 15 -5.715,-12.25; 16 -4.445,-12.25; 17 -3.175,-12.25; 18 -1.905,-12.25; 19 -0.635,-12.25; 20 0.635,-12.25; 21 1.905,-12.25; 22 3.175,-12.25; 23 4.445,-12.25; 24 5.715,-12.25 | smd 1.33 x 1.33: 39_1 -2.835,-0.405; 39_2 -1,-0.405; 39_3 0.835,-0.405; 39_4 -2.835,-2.24; 39_5 -1,-2.24; 39_6 0.835,-2.24; 39_7 -2.835,-4.075; 39_8 -1,-4.075; 39_9 0.835,-4.075 | drill 0.2 pad 0.3: 39_10 -1.917,-0.405; 39_11 -0.083,-0.405; 39_12 -2.835,-1.323; 39_13 -1,-1.323; 39_14 0.835,-1.323; 39_15 -1.917,-2.24; 39_16 -0.083,-2.24; 39_17 -2.835,-3.158; 39_18 -1,-3.158; 39_19 0.835,-3.158; 39_20 -1.917,-4.075; 39_21 -0.083,-4.075
SO016 = smd 0.6 x 1.2: 1 -4.445,-2.8; 2 -3.175,-2.8; 3 -1.905,-2.8; 4 -0.635,-2.8; 5 0.635,-2.8; 6 1.905,-2.8; 7 3.175,-2.8; 8 4.445,-2.8; 9 4.445,2.8; 10 3.175,2.8; 11 1.905,2.8; 12 0.635,2.8; 13 -0.635,2.8; 14 -1.905,2.8; 15 -3.175,2.8; 16 -4.445,2.8
SOT229P700X180-4N = smd 1.31 x 0.93: 1 -3.345,2.29; 2 -3.345,0; 3 -3.345,-2.29 | smd 1.31 x 3.24: 4 3.345,0
SO8 = smd 0.6 x 2.2: 1 -1.905,-2.6; 2 -0.635,-2.6; 3 0.635,-2.6; 4 1.905,-2.6; 5 1.905,2.6; 6 0.635,2.6; 7 -0.635,2.6; 8 -1.905,2.6
SOP65P640X110-28N = smd 1.473 x 0.356: 1 -2.921,4.216; 2 -2.921,3.581; 3 -2.921,2.921; 4 -2.921,2.286; 5 -2.921,1.626; 6 -2.921,0.965; 7 -2.921,0.33; 8 -2.921,-0.33; 9 -2.921,-0.965; 10 -2.921,-1.626; 11 -2.921,-2.286; 12 -2.921,-2.921; 13 -2.921,-3.581; 14 -2.921,-4.216; 15 2.921,-4.216; 16 2.921,-3.581; 17 2.921,-2.921; 18 2.921,-2.286; 19 2.921,-1.626; 20 2.921,-0.965; 21 2.921,-0.33; 22 2.921,0.33; 23 2.921,0.965; 24 2.921,1.626; 25 2.921,2.286; 26 2.921,2.921; 27 2.921,3.581; 28 2.921,4.216
JST-XH-04-PACKAGE-LONG-PAD = drill 1.016 long: 1 -3.81,0; 2 -1.27,0; 3 1.27,0; 4 3.81,0

### Placement (x,y rotation side)
BUTTONS/ENC  84.2,2.8 0 top
C1  39.8,14.33 270 top
C2  9.06,16.18 270 top
C3  35.84,6.68 270 top
C4  82.78,9.18 270 top
C5  79.45,9.36 270 top
C6  82.79,16.93 90 top
C7  42.6,14.3 90 top
C8  42.6,11.2 270 top
C9  64.86,5.8 270 top
C10  64.7,9 90 top
C11  34.84,32.33 180 top
C12  34.84,30.28 180 top
C13  49.73,58.57 0 top
C14  49.24,48.17 0 top
C15  49.04,37.87 0 top
C16  68.23,19.56 270 top
C17  37.7,14.3 270 top
C18  13.1,14.4 270 top
C19  13.1,17.6 90 top
C20  97.57,29.4 180 top
C21  90.36,28.52 0 top
C29  68.89,9.63 90 top
CN1  20.48,6.21 0 top
CON1  29.21,67.02 0 top
CON2  71.12,67.03 0 top
D1  76.08,18.46 180 top
D2  39.6,7.1 270 top
D3  1.5,52.4 90 top
D4  1.5,41.3 90 top
D5  12.7,52.2 90 top
D6  12.6,41.3 90 top
D7  23.5,52.3 90 top
D8  23.5,41.4 90 top
D9  34,52.1 90 top
D10  34,41.2 90 top
D11  54.3,50.7 90 top
D12  54.3,39.8 90 top
D13  64.3,52.13 90 top
D14  64.3,41.23 90 top
D15  75.9,52.13 90 top
D16  75.9,41.33 90 top
D17  87.41,53.69 90 top
D18  87.46,42.75 90 top
F1  8.4,33.7 0 top
G1  6.87,57.65 90 top
G2  6.76,45.75 90 top
G3  17.97,57.65 90 top
G4  18.06,45.65 90 top
G5  28.87,57.48 90 top
G6  28.86,45.28 90 top
G7  39.37,57.38 90 top
G8  39.26,45.18 90 top
G9  58.77,57.91 90 top
G10  58.76,45.41 90 top
G11  70.07,57.61 90 top
G12  70.06,45.21 90 top
G13  81.67,57.51 90 top
G14  81.66,44.91 90 top
G15  93.17,57.41 90 top
G16  93.26,45.31 90 top
G17  99.58,23.58 270 top
J1  48.29,25.91 270 top
J2  51.03,25.91 270 top
J3  53.77,25.91 270 top
J4  56.51,25.91 270 top
J5  59.25,25.91 270 top
J6  61.99,25.91 270 top
J8  5.05,25.65 90 top
J9  64.73,25.86 270 top
J10  67.34,25.87 270 top
J11  69.84,25.88 270 top
J12  95.79,12.89 90 top
L1  78.14,13.78 0 top
LCD  69.8,2.8 180 top
LED1  10.1,23.8 270 top
LED2  12.8,23.8 270 top
LED3  15.6,23.8 270 top
LED4  18.4,23.8 270 top
LED5  21.2,23.8 270 top
LED6  24.1,23.8 270 top
LED7  27.1,23.8 270 top
LED8  30.2,23.8 270 top
LED9  72.5,23.84 270 top
LED10  74.79,23.84 270 top
LED11  77.16,23.84 270 top
LED12  79.56,23.84 270 top
LED13  82.36,23.84 270 top
LED14  85.16,23.84 270 top
LED15  87.96,23.84 270 top
LED16  90.5,23.8 270 top
LED17  41,20 180 top
LED18  66.67,11.77 0 top
LED19  94.04,24.02 180 top
LED20  40.25,1.5 90 top
Q1  31.17,14.03 270 top
Q2  31.19,18.73 270 top
Q3  86.84,28.97 270 top
R1  9.62,50.82 0 top
R2  9.62,39.21 0 top
R3  20.82,50.82 0 top
R4  20.72,38.81 0 top
R5  31.59,50.92 0 top
R6  31.49,38.61 0 top
R7  41.89,50.92 0 top
R8  41.89,38.31 0 top
R9  61.19,51.05 0 top
R10  61.39,38.64 0 top
R11  72.39,50.65 0 top
R12  72.69,37.24 0 top
R13  84.49,50.85 0 top
R14  84.29,36.34 0 top
R15  95.79,50.85 0 top
R16  96.09,38.14 0 top
R17  57.1,22.2 180 top
R18  61.92,22.2 0 top
R19  51.88,22.36 0 top
R20  14.1,28.1 0 top
R21  26,28.3 0 top
R22  75.1,27.8 0 top
R23  82.66,28.97 0 top
R24  39.14,17.6 90 top
R25  28.64,13.93 270 top
R26  28.57,18.77 90 top
R27  73.09,9.63 270 top
R28  75.19,9.63 90 top
R29  70.99,9.63 270 top
R30  9.6,52.9 180 top
R31  9.6,41.3 180 top
R32  20.8,52.9 180 top
R33  20.7,40.9 180 top
R34  31.6,53 180 top
R35  31.5,40.7 180 top
R36  41.9,53 180 top
R37  41.9,40.4 180 top
R38  61.2,53.13 180 top
R39  61.4,40.73 180 top
R40  72.4,52.73 180 top
R41  72.7,39.43 180 top
R42  84.5,52.93 180 top
R43  84.3,38.43 180 top
R44  95.8,52.93 180 top
R45  96.1,40.23 180 top
R46  33.1,16.2 90 top
R47  46.5,21.5 0 top
R48  26.5,18.8 270 top
R49  26.5,15.7 270 top
R50  66.85,8.99 270 top
R51  42.7,20 270 top
R52  38.1,21.9 180 top
R53  66.4,29.23 0 top
R54  94.49,29.42 180 top
R55  94.11,26.86 90 top
R56  85.98,31.59 0 top
R57  42.59,2.42 90 top
S1  35.58,15.92 90 top
S2  65.77,18.34 90 top
U1  93.92,33.76 0 top
U2  53.88,6.89 180 top
U3  19.62,16.28 180 top
U4  29.84,6.58 270 top
U5  70.96,13.93 90 top
U6  41.5,29.92 90 top
X1  3.52,13.95 270 top
X2  87.15,13.24 270 top

### Tracks (layer width: path | path; a pad name or v marks a point on that pad's centre or on a via)
+3V3  (via drill 0.35)
  Top 0.305: J1.1 48.73,26.13 49.13,26.13 49.6,25.65 v49.6,25.2 | J2.1 51.47,26.13 51.87,26.13 52.05,25.95 52.05,25.65 v52.4,25.3 | J3.1 54.22,26.13 54.61,26.13 55.01,25.72 v55.01,25.2 | J4.1 56.95,26.13 57.35,26.13 57.53,25.95 57.53,25.57 v57.9,25.2 | J5.1 59.69,26.13 60.09,26.13 60.27,25.95 60.27,25.63 v60.7,25.2 | J6.1 62.04,26.52 63.3,26.52 | 63.3,26.52 J9.1 J10.1 J11.1 | 63.3,26.52 63.4,26.42 v63.4,25.1 | U3.16 23.4,12.81 23.4,12.75 23.22,12.57 19.83,12.57 19.65,12.75 19.65,14.21 20.25,14.81 U3.4 | U6.28 36.77,32.33 C11.1
  Top 0.406: C9.1 65.78,5.73 66.3,5.73 68.53,3.51 LCD.3 | U3.4 20.25,19.21 19.43,20.04 14.73,20.04 14.52,19.83 14.52,17.52 13.75,16.75 13.2,16.75 | v75.8,6.9 74.26,6.9 73.09,8.07 R27.2 | C19.1 13.2,16.75 | C18.1 13.1,16.65 13.2,16.75
  Top 0.508: C10.1 64.7,6.81 C9.1 64.67,6.65 63.89,5.87 63.89,3.66 63.13,2.9 U2.2 | U3.4 20.82,19.64 20.82,19.85 22.05,21.09 31.4,21.09 | v36.96,20.46 38.98,18.45 R24.2 40.09,17.49 40.09,16.5 40.46,16.14 40.47,16.14 40.71,15.9 40.71,14.38 41.64,13.45 C7.1 C8.1 42.26,12.05 40.32,10.11 40.32,9.97 D2.C | v36.96,20.46 36.34,21.09 31.4,21.09 | 80.49,9.17 C5.1 79.45,10.85 L1.P$2 | C19.1 4.53,16.75 X1.1 | R52.2 37.25,20.75 v36.96,20.46 | C12.1 C11.1 35.69,33.27 v35.83,33.41 | v75.8,6.9 80.47,6.9 | 80.47,6.9 82.53,6.9 C4.+ | 80.47,6.9 80.49,6.92 80.49,9.17 | X2.1 86.69,17.05 84.77,15.13 84.77,10.6 84.2,10.02 81.34,10.02 80.49,9.17 | v69,5.46 69,5.99 R50.2 67.49,8.78 C29.1 R29.2 R27.2 | 31.4,21.09 31.4,18.14 32.49,17.05 R46.2
  Bottom 0.508: v49.6,25.2 52.3,25.2 v52.4,25.3 54.91,25.3 v55.01,25.2 v57.9,25.2 v60.7,25.2 63.3,25.2 v63.4,25.1 | v49.6,25.2 51.81,22.98 79.12,22.98 85.68,16.42 86.52,16.42 X2.1 | v36.96,20.46 37.31,20.82 37.31,21.02 38.39,22.1 40.56,22.1 41.47,21.19 42.12,21.19 46.13,25.2 | v49.6,25.2 46.13,25.2 | 46.13,25.2 46.19,25.27 46.19,28.49 42.39,32.3 36.95,32.3 v35.83,33.41 | v69,5.46 69,3.27 LCD.3
+5V  (via drill 0.35)
  Top 0.508: v26.41,9.9 26.44,9.93 U4.3 | CN1.VBUS 18.29,10.27 17.25,11.32 14.91,11.32 14.1,10.5 v13.8,10.5 10.64,13.65 C2.+
  Bottom 0.508: v13.8,10.5 21.99,10.5 22.57,11.09 25.23,11.09 v26.41,9.9
A0
  Top 0.152: R17.4 54.58,23.05 54.33,23.3 54.33,23.36 54.2,23.49 50.05,23.49 J1.2 48.84,24.7 48.32,24.7 46.2,22.58 40.17,22.58 37.3,25.45 37.3,26.39 37.3,26.47 37.3,26.98 U6.1
A1
  Top 0.152: R17.3 56.25,23.5 56.25,23.59 56.05,23.8 52.48,23.8 J2.2 50.51,25.77 50.22,25.77 49.23,26.77 49.23,27.24 49.1,27.37 47.48,27.37 47.3,27.19 47.3,24.21 45.98,22.89 40.32,22.89 37.95,25.25 37.95,26.96 U6.2
A2
  Top 0.152: R17.2 57.15,23.4 57.15,23.59 56.65,24.1 54.92,24.1 J3.2 53.25,25.77 52.96,25.77 51.97,26.77 51.97,27.24 51.53,27.68 47.36,27.68 46.99,27.31 46.99,24.33 45.85,23.19 40.57,23.19 38.6,25.15 38.6,26.97 U6.3
A3
  Top 0.152: R17.1 58.4,23.36 J4.2 55.99,25.77 55.7,25.77 55.57,25.9 55.57,26.38 53.97,27.98 47.23,27.98 46.69,27.44 46.69,24.46 45.73,23.5 40.71,23.5 39.25,24.95 39.25,26.96 U6.4
A4
  Top 0.152: R18.8 60.72,23.15 60.72,23.78 59.4,25.1 | J5.2 59.4,25.1 | 59.4,25.1 59.12,25.1 57.45,26.77 57.45,27.24 56.4,28.29 47.1,28.29 46.39,27.57 46.39,24.59 45.6,23.8 40.9,23.8 39.87,24.83 U6.5
A5
  Top 0.152: R18.7 61.52,22.95 61.32,23.15 61.32,24.58 J6.2 61.47,25.77 61.18,25.77 60.19,26.77 60.19,27.24 57.64,29.79 42.48,29.79 41.36,30.9 40.49,30.9 39.87,31.52 U6.24
A6  (via drill 0.35)
  Top 0.152: J11.2 70.36,25.74 70.65,25.74 71.11,26.2 v71.11,26.97 | v68.56,28.54 67.87,29.23 R53.2 | v40.4,34.11 40.1,33.81 39.6,33.81 39.21,33.42 U6.25
  Bottom 0.152: v71.11,26.97 69.54,28.54 v68.56,28.54 46.83,28.54 42.59,32.78 41.73,32.78 v40.4,34.11
BLE_ALERT_LED
  Top 0.152: R57.2 43.34,3.27 43.82,2.79 45.27,2.79 U2.37
EN  (via drill 0.35)
  Top 0.152: U2.3 52.73,4.17 48.3,8.6 v48.3,11.1 | v33.3,18.4 32.97,18.73 Q2.3 33.38,19.82 S1.P$2 36.06,19.82 R24.1 39.14,15.84 C1.1 39.77,15.15 C17.1
  Bottom 0.152: v33.3,18.4 v33.29,18.39 33.29,15.65 36.94,12 47.4,12 v48.3,11.1
ENC_A  (via drill 0.35)
  Top 0.152: v47,15.4 45.58,15.4 U2.27
  Bottom 0.152: v47,15.4 47.8,14.61 51.8,14.61 52.34,15.14 63.59,15.14 63.8,15.35 71.15,15.35 71.31,15.51 72.87,15.51 73.98,14.39 73.98,8.96 75.43,7.51 76.58,7.51 81.28,2.8 BUTTONS/ENC.3
ENC_B  (via drill 0.35)
  Top 0.152: v47.1,14.3 45.41,14.3 U2.28
  Bottom 0.152: v47.1,14.3 51.93,14.3 52.46,14.84 63.72,14.84 63.92,15.04 71.28,15.04 71.44,15.21 72.74,15.21 73.68,14.27 73.68,8.16 75.55,6.29 75.63,6.29 BUTTONS/ENC.2
ENC_BUTTON  (via drill 0.35)
  Top 0.152: U2.30 45.97,11.2 46.48,11.2 46.67,11 v47,11
  Bottom 0.152: v47,11 47.54,11 48.05,10.49 48.55,10.49 52.59,14.53 63.84,14.53 64.05,14.74 71.4,14.74 71.56,14.9 72.62,14.9 73.36,14.16 73.36,7.65 75.47,5.54 75.47,5.52 76.58,4.41 BUTTONS/ENC.1
GND  (via drill 0.35)
  Top 0.152: CN1.ID CN1.GND 22.87,10.27 v22.9,10.3 | U3.1 24,19.14 v24,20.3 | U2.15 v59.6,17.5 | U2.39_3 U2.39_14 U2.39_6 | U2.39_5 U2.39_13 U2.39_2 | U2.39_1 U2.39_12 U2.39_4 U2.39_7 | U2.39_8 U2.39_18 | U2.39_9 U2.39_19 | v44.4,21.4 44.5,21.5 R47.1 | C16.2 66.69,18.71 v66.5,18.9 | LED20.C 38.57,1.5 v38.54,1.53
  Top 0.254: U2.38 43.73,1.63 v43.7,1.6 | U2.1 64.27,1.63 v64.3,1.6 | U4.1 32.85,9.21 v33.8,9.21 C3.- 35.84,11.76 S1.P$1 36.27,12.02 C17.2 | C8.2 42.04,9.79 v41.11,9.79 | v64.2,10.99 64.7,10.49 C10.2 | C17.2 37.73,13.48 C1.2 40.39,13.48 v40.92,12.95 | LED17.C 41.02,19.23 41.02,17.58 v42.3,16.3 42.6,16 C7.2 | v32.92,31.34 32.92,32.68 v31.48,34.12 | v36.64,14.99 36.92,14.71 36.92,14.48 37.7,13.71 C17.2
  Top 0.305: R6.1 30.64,37.44 v30.6,37.4 | R18.2 R18.1 59.84,21.35 59.59,21.1 | v59.5,22 59.59,21.91 59.59,21.1 | U2.15 59.59,21.1 | 59.59,21.1 59.34,21.35 R17.8 R17.7 R17.6 R17.5 55.35,21.35 54.34,22.36 R19.2 | C11.2 33.91,32.33 v32.92,31.34 v32.93,31.34 C12.2 | R53.1 v65.55,30.48 | U6.14 45.72,27.74 v47.14,29.17 | LED18.C 67.17,12.03 U5.8 | C9.2 65.99,3.82 LCD.4 | Q3.2 87.11,28.02 v87.19,27.94 | R56.1 84.09,31.59 v84.03,31.53
  Top 0.508: R10.1 60.54,37.46 v60.5,37.33 | v70.9,36.33 71.81,37.24 R12.1 71.84,37.76 v71.25,38.35 | R13.1 83.48,50.69 v83.48,49.73 | R15.1 94.66,51.13 v93.7,51.13 | R16.1 v94.01,38.14 v94,38.13 | R11.1 70.38,50.65 v70.3,50.73 | R8.1 v39.93,38.31 | R7.1 41,50.88 v41,49.4 | v30.7,49.6 30.74,49.64 R5.1 | R4.1 v18.71,38.81 v18.7,38.8 | v18.5,50.6 18.65,50.45 19.02,50.82 R3.1 | R2.1 8.77,37.97 v8.7,37.9 | LED2.C LED1.C v10.1,21 10.1,19.75 | LED2.C 13.02,22.38 13.3,22.1 13.08,22.1 LED2.C | LED5.C LED4.C LED3.C LED2.C | LED5.C 21.32,22.38 21.6,22.1 21.48,22.1 LED5.C | LED5.C LED6.C LED7.C 30.12,22.38 30.5,22 | LED9.C LED10.C LED11.C LED12.C LED13.C LED14.C | LED14.C LED15.C 87.08,22.42 87.12,22.38 LED16.C | R1.1 8.76,50.81 v8.76,49.64 | R9.1 59.52,51.05 v59.2,50.73 | R28.1 77.54,8.78 v77.89,8.43 77.84,8.38 79.31,8.38 C5.2 | 73.56,16.81 U5.4 | U5.8 U5.7 U5.6 U5.5 68.36,16.72 v68.38,16.74 | C6.- C4.- | C4.- 82.67,11.71 | v58.5,16.2 58.6,16.1 v58.6,13.9 | S2.P$1 v65.77,16.08 v65.78,16.09 | C2.- 10.1,19.75 | C19.2 11.39,18.45 10.1,19.75 | C18.2 13.1,13.2 v14,12.3 | 73.56,16.81 75.06,16.81 v75.1,16.77 | v82.61,37.47 82.61,37.17 R14.1 | LED14.C 85.16,21.05 v85.43,20.78 | v61.51,34.78 61.51,31.59 v61.73,31.37 | v80.92,11.56 82.64,11.56 C4.- | D1.A 73.93,17.18 73.56,16.81
  Top 0.61: LED8.C 30.5,22.08 30.5,22
  pour Bottom: 0,70 100,70 100,0 0,0
HOMEBTN
  Top 0.152: U2.9 62.57,11.6 64.45,11.6 64.81,11.24 64.81,10.89 65.06,10.63 65.3,10.63 65.43,10.49 65.43,9.28 65.47,9.23 65.52,9.23 65.83,8.92 65.83,7.77 68.75,4.86 84.68,4.86 BUTTONS/ENC.5
IO0  (via drill 0.35)
  Top 0.152: v43.2,17.7 43.64,18.14 U2.25 46.62,19.38 46.62,22.14 46.76,22.28 47.95,22.28 48.08,22.14 48.08,21.51 v48.92,20.67 | S2.P$2 65.77,21.23 v66.6,20.4 v66.61,20.41 C16.1 | Q1.3 32.27,14.52 R46.1 34.75,15.35 v36,14.1
  Bottom 0.152: v36,14.1 39.6,14.1 41.69,16.19 41.69,16.55 42.05,16.91 42.41,16.91 v43.2,17.7 | v66.6,20.4 66.3,20.1 63.53,20.1 63.02,19.59 52.43,19.59 51.36,20.67 v48.92,20.67
IO2  (via drill 0.35)
  Top 0.152: v41.99,17.98 42.7,18.7 R51.2 | R47.2 48.16,20.68 48.16,19.2 U2.24 48.16,17.54 v48.2,17.5
  Bottom 0.152: v41.99,17.98 42.63,17.98 42.95,18.31 43.45,18.31 43.86,17.9 45.14,17.9 46.75,16.29 47.25,16.29 47.61,16.65 47.61,16.91 v48.2,17.5
LEFTBTN  (via drill 0.35)
  Top 0.152: v47.2,10.09 46.9,10.39 46.75,10.39 46.62,10.52 U2.31 | v79.22,6.12 75.68,6.12 75.63,6.17 v73.99,6.17
  Bottom 0.152: BUTTONS/ENC.6 85.97,6.12 v79.22,6.12 | v47.2,10.09 50.58,6.71 56.45,6.71 64.17,14.43 71.53,14.43 71.69,14.6 72.49,14.6 73.06,14.03 73.06,7.1 v73.99,6.17
N$1
  Bottom 1.016: CON1.P$2 12.7,65.84 9.26,62.4 8.6,62.4 7.1,60.9 7.1,59.2 7.2,59.1 | 7.2,59.1 8.65,57.65 G1.2 | 7.2,59.1 7.2,58.1 D3.3 3.9,54.8 2.3,54.8 1.6,54.1 1.6,50.8 2.54,49.86 D3.1
N$2
  Bottom 1.016: CON1.P$4 17.78,65.84 13.58,61.64 13.58,56.28 7,49.7 7,47.5 7.1,47.4 | G2.2 8.75,45.75 7.1,47.4 | 7.1,47.4 7.1,46.9 D4.3 3.8,43.6 2.3,43.6 1.7,43 1.7,39.3 2.24,38.76 D4.1
N$3
  Bottom 1.016: D5.1 13.84,49.66 12.7,50.8 12.7,52.8 14.1,54.2 14.7,54.2 D5.3 18.15,57.65 | 18.15,57.65 G3.2 | 18.15,57.65 18.15,61.05 18.76,61.66 18.76,61.74 22.86,65.84 CON1.P$6
N$4
  Bottom 1.016: CON1.P$8 27.94,65.74 23.84,61.64 23.84,57.74 22.9,56.8 22.9,47.51 22.16,46.77 22.12,46.77 21,45.65 G4.2 18.05,45.65 16.24,43.84 D6.3 13.96,43.84 13.9,43.9 12.76,42.76 12.76,39.84 13.84,38.76 D6.1
N$5
  Bottom 1.016: CON1.P$10 33.02,65.84 28.92,61.74 28.92,59.18 | G5.2 30.62,57.48 28.92,59.18 | 28.92,59.18 28.92,57.72 D7.3 26.44,54.84 27.56,53.72 27.69,53.72 28.42,52.99 28.42,51.31 27.89,50.78 27.06,50.78 D7.1
N$6
  Bottom 1.016: D8.1 25.04,38.86 23.7,40.2 23.7,42.9 24.74,43.94 D8.3 27.38,45.28 G6.2 31.6,45.28 32.72,46.4 33.15,46.4 34,47.25 34,61.74 38.1,65.84 CON1.P$12
N$7
  Bottom 1.016: CON1.P$14 43.18,65.84 39.5,62.16 39.5,59.1 | 39.5,59.1 41.22,57.38 G7.2 | 39.5,59.1 39.5,57.6 37.9,56 | 37.9,56 D9.3 | 37.9,56 37.9,53.81 39.02,52.69 39.02,51.41 38.09,50.48 37.76,50.48 36.84,49.56 D9.1
N$8
  Bottom 1.016: CON1.P$16 48.26,65.84 44.36,61.94 44.36,47.11 43.35,46.1 42.72,46.1 G8.2 39.88,45.18 38.44,43.74 D10.3 36.1,43.3 34.9,43.3 33.91,42.31 33.91,40.31 35.55,38.66 D10.1
N$9
  Bottom 1.016: 58.71,59.12 58.71,61.36 55.35,64.72 55.35,66.29 CON2.P$2 | G9.2 59.92,57.91 58.71,59.12 | 58.71,59.12 58.71,55.11 D11.3 56.8,53.2 55.77,53.2 54.51,51.94 54.51,49.82 56.17,48.16 D11.1
N$10  (via drill 0.35)
  Top 1.016: G10.2 62.32,46.43 62.69,46.43 63.7,47.43 v63.7,49.93
  Bottom 1.016: G10.2 61.1,45.61 58.28,45.61 56.84,44.17 D12.3 56.57,42.07 55.24,42.07 54.35,41.18 54.35,38.65 55.09,37.91 55.16,37.91 55.81,37.26 D12.1 | v63.7,49.93 63.7,61.38 60.44,64.64 60.44,66.28 CON2.P$4
N$11
  Top 1.016: D13.1 66.54,49.59 65.42,50.71 65.09,50.71 64.46,51.34 64.46,53.02 65.19,53.75 65.92,53.75 D13.3
  Bottom 1.016: 69.7,60.03 72.12,57.61 G11.2 | 69.7,60.03 69.7,57.53 D13.3 | CON2.P$6 64.77,66.44 69.7,61.51 69.7,60.03
N$12
  Top 1.016: D14.1 65.24,38.69 64.5,39.43 64.5,42.33 65.8,43.63 66.7,43.63 D14.3 | G12.2 73.62,46.23 73.99,46.23 74.89,47.12 74.89,48.38 74.69,48.58 74.69,54.23 74.9,54.44 74.9,61.54 69.85,66.59 CON2.P$8
  Bottom 1.016: D14.3 70.43,43.77 70.85,44.19 71.28,44.19 72.3,45.21 G12.2
N$13
  Top 1.016: D15.3 77.62,53.85 76.99,53.85 75.96,52.82 75.96,51.64 76.89,50.71 77.02,50.71 78.14,49.59 D15.1
  Bottom 1.016: 80.9,59.23 80.9,61.5 78.55,63.85 76.67,63.85 75.07,65.45 75.07,66.89 CON2.P$10 | 80.9,59.23 82.62,57.51 G13.2 | D15.3 80.9,57.13 80.9,59.23
N$14  (via drill 0.35)
  Top 1.016: v80.9,46.23 78.54,43.87 D16.3 | G14.2 85.58,44.91 86.7,46.03 86.7,60.53 83.57,63.66 82.16,63.66 80.01,65.81 CON2.P$12
  Bottom 1.016: G14.2 82.22,44.91 v80.9,46.23 | D16.1 78.3,38.93 76.7,38.93 76.7,40.15 76.15,40.7 76.15,41.96 77.05,42.85 77.42,42.85 D16.3
N$15
  Bottom 1.016: 92.7,59.83 92.3,60.23 92.3,60.26 88.15,64.41 86.62,64.41 85.39,65.64 85.39,66.73 CON2.P$14 | 92.7,59.83 95.12,57.41 G15.2 | 92.7,59.83 92.7,58.98 D17.3 88.61,56.23 87.66,55.28 87.66,52.36 88.87,51.15 D17.1
N$16
  Top 0.813: 97.1,61.47 96.74,61.84 93.78,61.84 92.83,62.79 92.77,62.84 92.72,62.9 90.17,65.45 CON2.P$16
  Top 1.016: G16.2 96.2,45.31 97.02,46.13 97.25,46.13 98.22,47.1 98.22,60.36 97.1,61.47
  Bottom 1.016: G16.2 90.02,45.31 D18.3 89.15,45.29 87.71,43.85 87.71,41.33 88.83,40.21 D18.1
N$17
  Top 0.152: Q1.1 29.42,14.23 29.42,13.86 R25.2
N$18
  Top 0.152: R26.2 30.13,19.62 Q2.1
N$19
  Top 0.305: LED1.A 12.13,27.25 R20.1
N$20
  Top 0.305: LED2.A 13.7,26.12 R20.2
N$21
  Top 0.305: R20.3 14.87,26.88 14.87,26.67 15.6,25.94 LED3.A
N$22
  Top 0.305: R20.4 16.37,27.25 LED4.A
N$23
  Top 0.305: LED5.A 23.43,27.45 R21.1
N$24
  Top 0.305: LED6.A 25.6,26.72 R21.2
N$25
  Top 0.305: LED7.A 27.1,25.7 26.4,26.4 R21.3
N$26
  Top 0.152: R1.2 10.45,50.84 R30.1 10.45,54.07 G1.1
N$27
  Top 0.305: R21.4 29.53,25.22 LED8.A
N$28
  Top 0.305: R22.1 73.8,26.56 LED9.A
N$29
  Top 0.305: LED10.A 74.7,25.35 R22.2
N$30
  Top 0.305: LED11.A 76.98,25.26 75.87,26.37 75.87,26.58 R22.3
N$31
  Top 0.305: R22.4 77.87,26.95 LED12.A
N$32
  Top 0.305: R23.1 81.73,27.75 81.73,27.38 82.36,26.75 LED13.A
N$33
  Top 0.305: R23.2 82.53,27.85 82.53,27.22 84.49,25.26 LED14.A
N$34
  Top 0.305: R23.3 83.43,27.75 83.43,27.54 84.43,26.54 86.68,26.54 LED15.A
N$35
  Top 0.152: Q2.2 30.19,16.33 R25.1 28.24,14.78 26.65,13.19 26.15,13.19 24.56,14.78 22.82,14.78 U3.14
N$36
  Top 0.152: Q1.2 30.17,13.81 30.87,14.51 30.87,18.27 30.73,18.41 29.06,18.41 R26.1 28.57,16.99 28.61,16.95 28.61,16.45 27.98,15.82 22.6,15.82 U3.13
N$37
  Top 0.152: R55.2 95.34,28.94 R54.1
  Top 0.305: C20.2 96.72,29.29 96.72,26.44 G17.1
  Top 0.813: R54.1 96.59,29.42 96.72,29.29
  Bottom 1.016: U1.4 97.73,26.81 G17.1
N$38
  Top 0.152: R18.6 62.32,23.2 62.32,23.42 62.32,23.62 62.8,24.1 63.63,24.1 J9.2
N$39
  Top 0.152: CN1.D- 19.36,10.6 19.36,11.52 19.23,11.66 18.32,11.66 17.19,12.79 17.19,14.18 17.71,14.7 U3.6
N$40
  Top 0.152: CN1.D+ 20.16,10.6 20.16,11.52 19.03,12.65 18.59,12.65 18.46,12.79 18.46,14.18 18.98,14.7 U3.5
N$41
  Top 0.152: J10.2 67.45,25.09 67.45,24.86 66.4,23.8 63.97,23.8 R18.5
N$42
  Top 0.508: U4.2 U4.4 34.92,3.23 C3.+ 38.8,4.16 D2.A
N$43
  Top 0.305: R23.4 85.02,27.06 89.03,27.06 90.5,25.59 LED16.A
N$44
  Top 0.152: C29.2 R29.1 71.64,10.48 71.99,10.83 | R28.2 R27.1 72.34,10.48 71.99,10.83 | U5.3 73.53,14.53 71.99,14.53 71.29,13.83 71.29,11.53 71.99,10.83
N$45
  Top 0.152: G2.1 9.3,42.45 R31.1 10.45,39.23 R2.2
N$46
  Top 0.152: U3.2 22.84,19.08 23.67,18.25 25.1,18.25 R48.1
N$47
  Top 0.152: R3.2 21.65,50.84 R32.1 21.65,53.97 G3.1
N$48
  Top 0.152: R49.1 22.85,16.55 21.5,17.9 21.5,19.05 U3.3
N$49
  Top 0.152: R4.2 21.55,38.83 R33.1 21.55,42.16 G4.1
N$50
  Top 0.152: LED20.A 42.52,1.5 R57.1
N$51
  Top 0.152: R5.2 R34.1 32.45,53.9 G5.1
N$52
  Top 0.152: R6.2 R35.1 32.35,41.79 G6.1
N$53
  Top 0.152: G7.1 42.75,54 R36.1 R7.2
N$54
  Top 0.254: LED18.A 66.85,10.84 R50.1
N$55
  Top 0.152: R8.2 R37.1 42.75,41.69 G8.1
N$56
  Top 0.152: R9.2 R38.1 62.05,54.63 G9.1
N$57
  Top 0.152: R10.2 R39.1 62.25,41.92 G10.1
N$58
  Top 0.152: G11.1 73.25,54.43 R40.1 R11.2
N$59
  Top 0.152: G12.1 72.6,41.39 72.29,41.08 72.29,40.58 72.65,40.22 72.76,40.22 R41.1 R12.2
N$60
  Top 0.152: R13.2 R42.1 85.35,53.83 G13.1
N$61
  Top 0.152: R14.2 R43.1 85.15,41.42 G14.1
N$62
  Top 0.152: G15.1 96.65,53.93 R44.1 R15.2
N$63
  Top 0.152: R16.2 R45.1 96.95,41.62 G16.1
N$64
  Top 0.152: LED17.A 42.6,20.75 R51.1
N$65
  Top 0.508: U5.2 74.31,13.29 76.42,15.4 L1.P$1 78.14,18.37 D1.C
N$66
  Top 0.406: R55.1 94.04,25.94 LED19.A
N$67
  Top 0.305: Q3.3 88.39,28.52 C21.1
  Top 1.016: C21.1 89.51,31.06 U1.1
OE  (via drill 0.35)
  Top 0.152: R19.1 50.02,22.8 v48.8,22.8 | v47,16.9 46.97,16.87 45.4,16.87 | 45.4,16.87 U2.26 | v41.79,21.97 42.19,21.58 43.34,21.58 43.48,21.45 43.48,18.55 43.23,18.31 42.95,18.31 42.59,17.95 42.59,17.45 42.95,17.09 43.45,17.09 43.46,17.1 45.17,17.1 45.4,16.87 | U6.23 40.53,31.71 v40.74,31.51 | v38.08,23.29 38.95,22.41 R52.1
  Bottom 0.152: v48.8,22.8 47,21 v47,16.9 | v40.74,31.51 42.49,31.51 45.71,28.29 45.71,25.46 44.14,23.9 43.71,23.9 v41.79,21.97 40.48,23.29 v38.08,23.29
RIGHTBTN
  Top 0.152: U2.8 62.97,9.93 63.48,9.93 63.61,9.79 63.61,9.57 64.25,8.93 65.39,8.93 65.53,8.79 65.53,7.59 68.57,4.55 82.07,4.55 83.82,2.8 BUTTONS/ENC.4
RX  (via drill 0.35)
  Top 0.152: v47.2,7.1 46.81,6.71 U2.34 | v28,16.7 26.75,17.95 R48.2
  Bottom 0.152: v47.2,7.1 47.2,9.2 45.7,10.7 34,10.7 v28,16.7
SCL  (via drill 0.35)
  Top 0.152: R18.4 63.22,21.22 62.2,20.2 v62.1,20.2 62.8,20.2 64.19,18.8 64.19,13.26 v65.26,12.2 | X1.4 6.03,7.63 6.21,7.63 7.72,6.12 7.72,5.38 12,1.09 37.24,1.09 38.45,2.3 40.68,2.3 40.87,2.49 v41.46,2.49 | v36,26.38 37,25.39 37,25.22 39.68,22.55 39.68,20.34 v39.71,20.31 40.14,19.88 41.49,19.88 41.63,19.75 41.63,18.49 41.38,18.24 41.38,17.73 42.21,16.91 42.55,16.91 43.63,15.82 43.63,9.58 43.19,9.14 43.19,5.85 44.28,4.76 44.54,4.76 45.26,4.04 U2.36 v47.01,4.17 v47.02,4.18 | U6.26 38.58,31.58 v38.4,31.4 | v69.91,8 69.91,6.49 70.31,6.09 70.31,6.07 v70.91,5.46
  Bottom 0.152: v36,26.38 36,26.43 35.39,27.04 35.39,28.39 v38.4,31.4 | X2.4 75.57,21.01 64.56,21.01 64.06,20.5 63.64,20.5 63.63,20.5 62.99,20.5 62.7,20.2 v62.1,20.2 61.81,20.49 51.97,20.49 49.05,23.41 45.45,23.41 42.44,20.4 39.8,20.4 v39.71,20.31 | v69.91,8 65.7,12.2 v65.26,12.2 | v47.02,4.18 44.14,4.18 43.65,3.69 42.66,3.69 v41.46,2.49 | v70.91,5.46 73.57,2.8 LCD.1
SDA  (via drill 0.35)
  Top 0.152: R18.3 62.47,21.5 62.47,22.09 62.57,22.2 63.5,22.2 v64.2,21.5 64.5,21.2 64.5,13.82 65.87,12.45 65.87,11.95 65.71,11.79 v65.71,11.09 | v41.69,9 42.6,9 43.17,9.57 43.2,9.57 43.33,9.71 43.33,14.1 43.2,14.23 41.54,14.23 41.19,14.58 41.19,16.1 40.58,16.71 40.58,17.69 40.22,18.05 40.22,19.04 39.68,19.57 39.03,19.57 v38.2,20.4 37.98,20.62 37.98,22.55 37.84,22.68 36.58,22.68 35.7,23.56 35.7,25.77 v35.09,26.37 | v43.8,7.9 43.88,7.98 U2.33 | X1.3 11,5.2 11,4.43 14.03,1.4 37.12,1.4 38.32,2.6 40.55,2.6 41.95,4 43.1,4 v43.4,4.3 | U6.27 37.92,31.83 v37.49,31.4 | v68.4,7.7 69.6,6.5 69.6,6.37 70,5.97 v70,5.48
  Bottom 0.152: v41.69,9 42.9,9 43.8,8.1 v43.8,7.9 43.8,4.7 v43.4,4.3 | v35.09,26.37 35.09,26.91 35.09,26.92 35.09,29 v37.49,31.4 | X2.3 87.13,11.97 85,14.1 85,16.42 79.92,21.5 v64.2,21.5 63.5,20.8 62.36,20.8 62.35,20.81 52.08,20.81 49.18,23.71 45.32,23.71 42.32,20.71 40.17,20.71 39.96,20.91 39.46,20.91 38.94,20.4 v38.2,20.4 | LCD.2 71.07,4.41 v70,5.48 | v68.4,7.7 65.71,10.39 v65.71,11.09
SIG1  (via drill 0.35)
  Top 0.152: R20.8 12.34,28.95 v11.77,29.52 7.75,33.53 7.75,34.37 7.4,34.72 7.4,51.7 8.6,52.9 R30.2 | v41.95,24.55 41.95,25.04 40.96,26.03 40.9,26.03 40.53,26.4 U6.6
  Bottom 0.152: v41.95,24.55 16.74,24.55 v11.77,29.52
SIG2  (via drill 0.35)
  Top 0.152: R20.7 v13.7,29.99 12.3,31.39 12.3,34.18 9.74,36.73 9.74,40.31 R31.2 | v43.74,24.5 42.85,24.5 42.25,25.1 42.25,25.17 41.17,26.25 U6.7
  Bottom 0.152: v13.7,29.99 13.7,28.48 17.02,25.16 42.2,25.16 42.85,24.5 v43.74,24.5
SIG3  (via drill 0.35)
  Top 0.152: v44.42,25.11 42.9,25.11 41.83,26.18 U6.8 | R20.6 14.62,29.07 v14.62,29.97 12.61,31.98 12.61,36.96 11.2,38.37 11.2,44.6 13,46.4 15.5,46.4 17.5,48.4 17.5,50.46 18.25,51.21 18.26,51.21 R32.2
  Bottom 0.152: v14.62,29.97 14.62,28.28 17.44,25.46 42.33,25.46 42.68,25.11 v44.42,25.11
SIG4  (via drill 0.35)
  Top 0.152: R20.5 v16.43,29.98 16.43,34.38 20.08,38.03 20.46,38.03 20.6,38.16 20.6,40.15 R33.2 | v45.1,25.72 42.94,25.72 42.47,26.19 U6.9
  Bottom 0.152: v45.1,25.72 42.5,25.72 42.45,25.77 20.64,25.77 v16.43,29.98
SIG5  (via drill 0.35)
  Top 0.152: v36,27.29 34.3,27.29 31.2,24.19 20.2,24.19 20.07,24.33 20.07,26.12 22.08,28.13 23.68,28.13 R21.8 20.6,33.25 20.6,36.47 22.36,38.23 22.36,43.77 27.89,49.31 27.89,50.14 R34.2 | v41.99,28.27 42.29,27.96 42.8,27.96 43.13,27.64 U6.10
  Bottom 0.152: v41.99,28.27 36.97,28.27 v36,27.29
SIG6
  Top 0.152: R35.2 29.9,39.95 29.9,38.05 25.95,34.09 25.95,29.5 R21.7 25.95,28.8 25.95,28.3 26.12,28.13 27.82,28.13 28.23,28.54 37.65,28.54 37.98,28.87 42.55,28.87 43.59,27.83 43.59,27.19 U6.11
SIG7
  Top 0.152: R36.2 39.65,51.6 39.65,44.38 37.81,42.55 35.58,42.55 34.69,41.65 34.69,41.29 33.07,39.67 33.07,37.97 32.94,37.83 31.89,37.83 30.85,36.79 29.55,36.79 26.85,34.09 26.85,29.6 R21.6 26.4,28.85 26.73,28.52 26.93,28.52 26.98,28.47 27.69,28.47 28.06,28.84 37.52,28.84 37.85,29.18 42.91,29.18 44.25,27.83 44.25,27.17 U6.12
SIG8
  Top 0.152: R21.5 30.83,29.15 | R37.2 40.5,39.85 35.37,39.85 33.37,37.86 33.37,37.84 30.83,35.29 30.83,29.15 | 30.83,29.15 37.4,29.15 37.73,29.48 43.23,29.48 45.08,27.64 U6.13
SIG9  (via drill 0.35)
  Top 0.152: R22.8 73.67,28.78 v73.67,29.8 | R38.2 61.1,52.38 v61.1,49.83 61.02,49.83 59.35,48.16 59.35,37.46 58.05,36.17 53.95,36.17 51.79,34 46.91,34 45.75,32.84 U6.15 | v71.86,36.16 73.32,34.7 v73.32,31.78
  Bottom 0.152: v61.1,49.83 61.58,49.83 63.25,48.16 63.25,44.7 62.77,44.22 60.49,44.22 59.55,43.28 59.55,42.46 61.97,40.04 68.26,40.04 71.86,36.44 v71.86,36.16 | v73.32,31.78 73.67,31.43 v73.67,29.8
SIG10  (via drill 0.35)
  Top 0.152: R22.7 74.7,29.68 v74.58,29.8 | R39.2 60.4,40.73 59.7,40.03 59.7,37.38 58.18,35.86 54.08,35.86 53.3,35.08 v53.3,34.34 58.73,34.34 60.45,32.62 v60.45,31 | v50,34.61 49.7,34.3 45.94,34.3 45.08,33.44 U6.16
  Bottom 0.152: v74.58,29.8 74.53,29.8 73.92,29.19 61.31,29.19 60.45,30.05 v60.45,31 | v50,34.61 50.12,34.49 53.14,34.49 v53.3,34.34
SIG11  (via drill 0.35)
  Top 0.152: R22.6 v75.5,29.69 v75.49,29.7 | 70.5,45 70.5,39.63 v67.5,36.63 | R40.2 71.55,52.01 72.27,51.3 72.27,50.01 70.5,48.24 70.5,45.13 70.5,45 | v77.28,31.47 75.75,33 75.75,41.68 73.77,43.66 71.84,43.66 70.5,45 | v54.68,36.77 54.13,36.77 52.16,34.8 50.66,34.8 50.25,35.21 49.75,35.21 49.23,34.7 45.7,34.7 44.42,33.42 U6.17
  Bottom 0.152: v75.49,29.7 75.54,29.7 76.15,29.09 76.65,29.09 77.28,29.72 v77.28,31.47 | v54.68,36.77 55.02,36.77 55.63,36.17 58.05,36.17 58.52,36.63 v67.5,36.63
SIG12  (via drill 0.35)
  Top 0.152: R22.5 v76.4,29.7 | R41.2 71.85,38.6 72.81,37.64 72.81,36.59 72.94,36.46 74.03,36.46 74.23,36.26 | 74.23,36.26 v74.92,36.95 | U6.18 43.79,32.01 44.48,31.31 58.31,31.31 59.34,30.28 63.63,30.28 65.05,31.7 72.55,31.7 73.07,31.18 73.68,31.18 74.23,31.72 v74.23,31.79 74.23,36.26
  Bottom 0.152: v74.23,31.79 74.31,31.79 v76.4,29.7
SIG13  (via drill 0.35)
  Top 0.152: R42.2 82,51.28 v82,40.04 | U6.19 43.13,32.11 44.23,31.01 58.18,31.01 59.21,29.98 63.76,29.98 65.17,31.39 72.13,31.39 72.67,30.86 80.1,30.86 v80.35,31.11 80.35,32.65 80.36,32.67 80.36,34.82 81.83,36.28 v81.96,36.15 | v80.44,29.89 80.51,29.82 R23.8
  Bottom 0.152: v81.96,36.15 82,36.19 v82,40.04 | v80.35,31.11 80.44,31.02 v80.44,29.89
SIG14
  Top 0.152: U6.20 42.47,31.98 43.74,30.7 58.02,30.7 59.05,29.68 63.89,29.68 65.3,31.09 72,31.09 72.69,30.4 73.42,30.4 73.51,30.5 81.68,30.5 81.81,30.36 81.81,30.26 R23.7 82.29,29.82 82.35,29.88 82.3,29.93 82.61,30.25 82.61,30.36 83.42,31.18 83.42,31.78 84.17,32.53 84.17,36.98 83.45,37.7 R43.2
SIG15
  Top 0.152: R44.2 95.67,52.21 95.67,49.88 93.25,47.46 93.25,37.83 87.79,32.37 86.23,32.37 86.1,32.23 86.1,31.19 85.56,30.65 83.79,30.65 83.51,30.36 83.51,30.27 R23.6 82.71,29.47 82.71,29.27 82.58,29.14 77.89,29.14 76.68,27.93 65.47,27.93 64.78,28.63 59.66,28.63 57.89,30.4 42.79,30.4 41.83,31.36 U6.21
SIG16
  Top 0.152: R45.2 95.25,39.5 95.97,38.78 95.97,37.68 95.97,37.49 95.83,37.36 93.98,37.36 88.77,32.16 88.77,31.43 86.53,29.19 84.94,29.19 84.32,29.82 R23.5 83.51,29.37 83.51,29.27 83.08,28.84 78.02,28.84 76.81,27.63 65.35,27.63 64.65,28.32 59.53,28.32 57.77,30.09 42.67,30.09 41.35,31.41 41.35,31.76 41.17,31.94 U6.22
SOLENOIDS_ON  (via drill 0.35)
  Top 0.152: Q3.1 86.83,31.01 R56.2 87.88,31.59 v87.94,31.65 | v70.44,23.77 70.44,14.29 v69.98,13.83 | v63.98,12.55 63.47,13.06 U2.10
  Bottom 0.152: v87.94,31.65 85.01,31.65 84.28,30.92 81.39,30.92 80.6,31.71 79.7,31.71 76.78,28.79 75.46,28.79 v70.44,23.77 | v69.98,13.83 65.26,13.83 v63.98,12.55
TX  (via drill 0.35)
  Top 0.152: v47,5.5 46.94,5.44 U2.35 | v26.4,13.8 26.4,14.75 R49.2
  Bottom 0.152: v47,5.5 47,6.44 46.59,6.85 46.59,8.9 45.1,10.39 35.8,10.39 35.77,10.39 29.8,10.39 v26.4,13.8
V+
  Top 1.27: F1.2_2 14.35,36.45 12.73,38.08 12.73,39.44 13.69,40.41 14.25,40.41 D6.2
  Bottom 1.27: F1.2_1 F1.2_2
  pour Top: 0.2,70 100,70 100,35 0.2,35
VCC  (via drill 0.35)
  Top 0.152: v95.42,24.75 95.42,24.66 LED19.C
  Top 0.305: R54.2 95.19,30.97 | 95.19,30.97 U1.3 | 95.19,30.97 95.78,30.38 97.37,30.38 98.34,29.4 C20.1
  Top 1.27: J8.1 2.45,25.75 F1.1_1 F1.1_2
  Bottom 0.152: 94.32,24.74 94.33,24.75 v95.42,24.75
  Bottom 1.27: F1.1_2 7.59,33.7 9.75,31.54 15.25,31.54 15.26,31.55 31.06,31.55 34.88,35.38 41.35,35.38 43.67,33.06 73.7,33.06 73.95,33.3 93.55,33.3 U1.3 95.19,28.17 94.32,27.3 94.32,24.74 94.32,22.91 96.19,21.04 G17.3
VDD
  Top 0.508: U5.1 74.02,12.49 74.87,12.49 75.17,12.79 75.17,13.03 75.96,13.82 80.4,13.82 80.9,14.32 80.9,17.57 C6.+
  Top 1.016: C6.+ 82.94,19.61 92.29,19.61 | C21.2 91.92,28.52 92.05,28.39
  Top 1.27: U1.2 92.05,31.06 92.05,28.39 92.05,26.63 92.29,26.39 92.29,21.61 | J12.1 92.29,13.89 92.29,19.61 92.29,21.61 | G17.2 96.15,22.69 95.59,22.69 94.51,21.61 92.29,21.61